# EasyEDA Pro project RK3566_handy_V1.0.epro, board PCB1_2
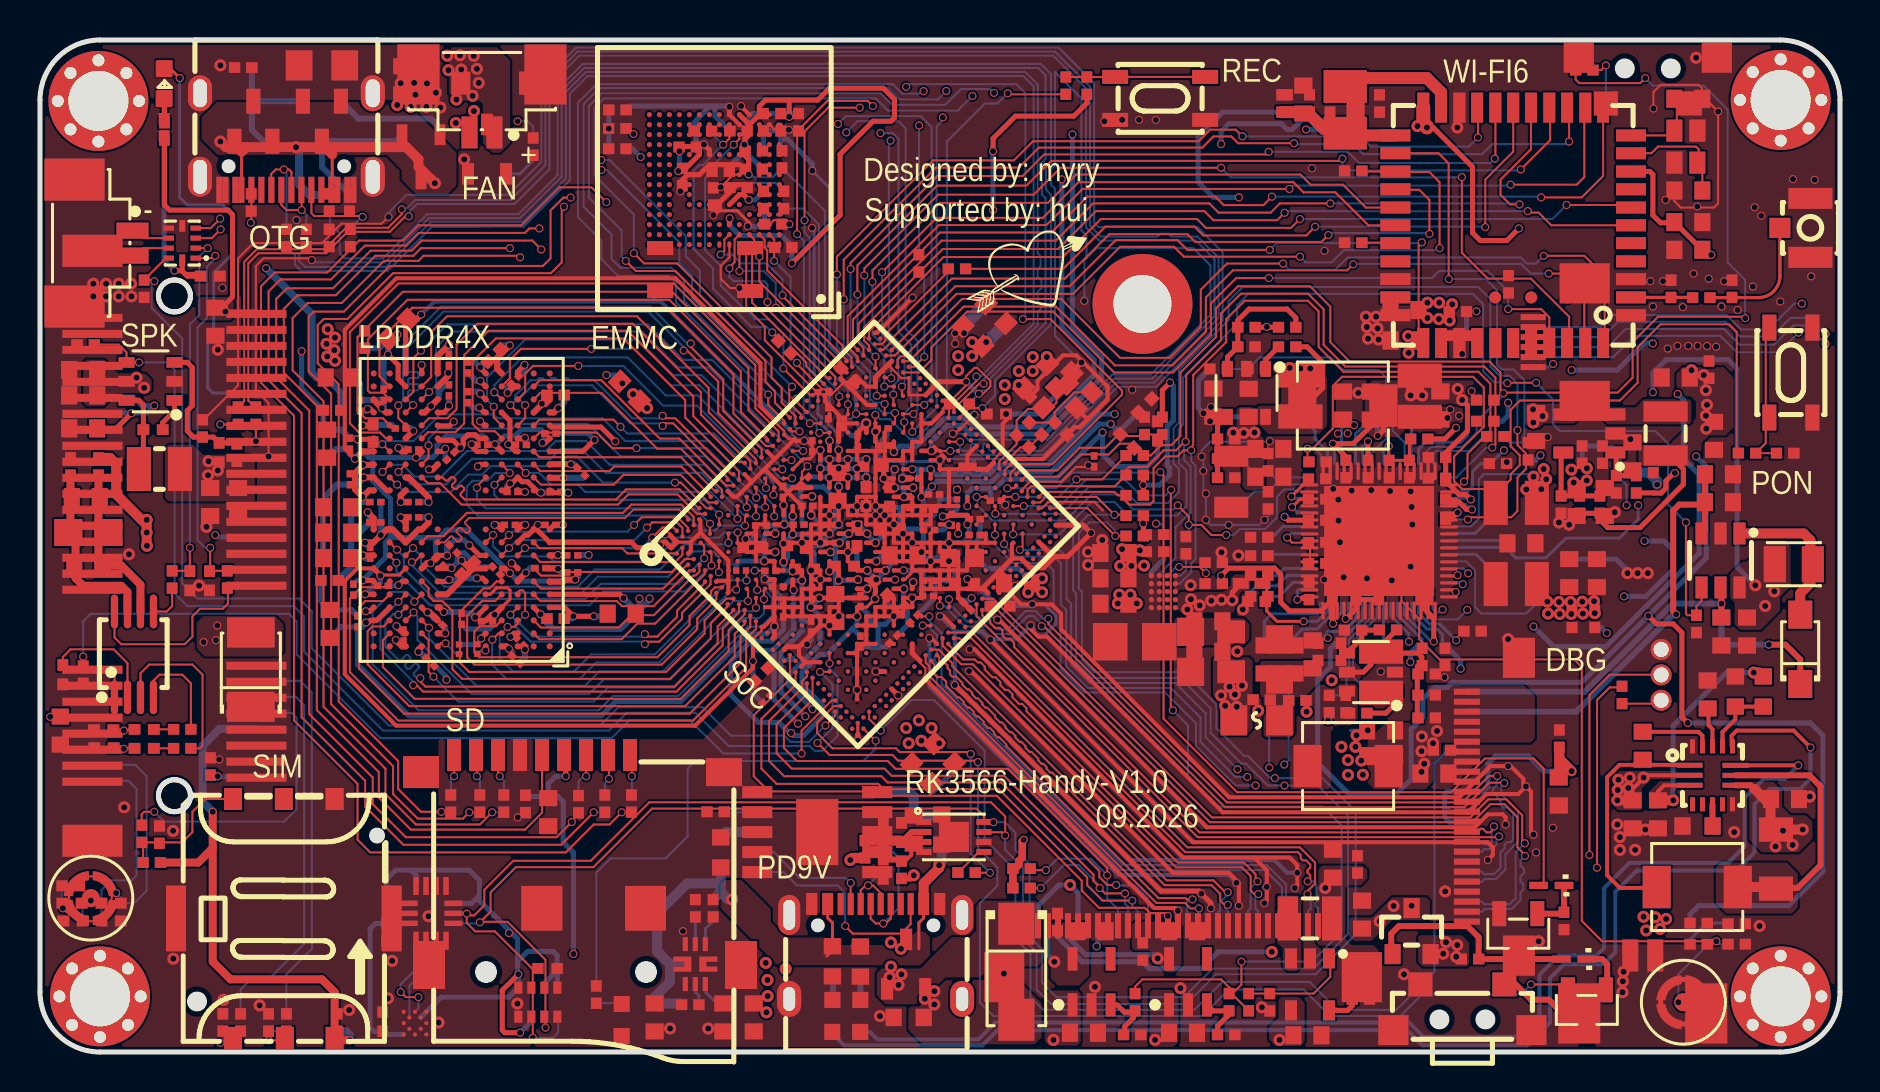
[diagram p25: board, top side]
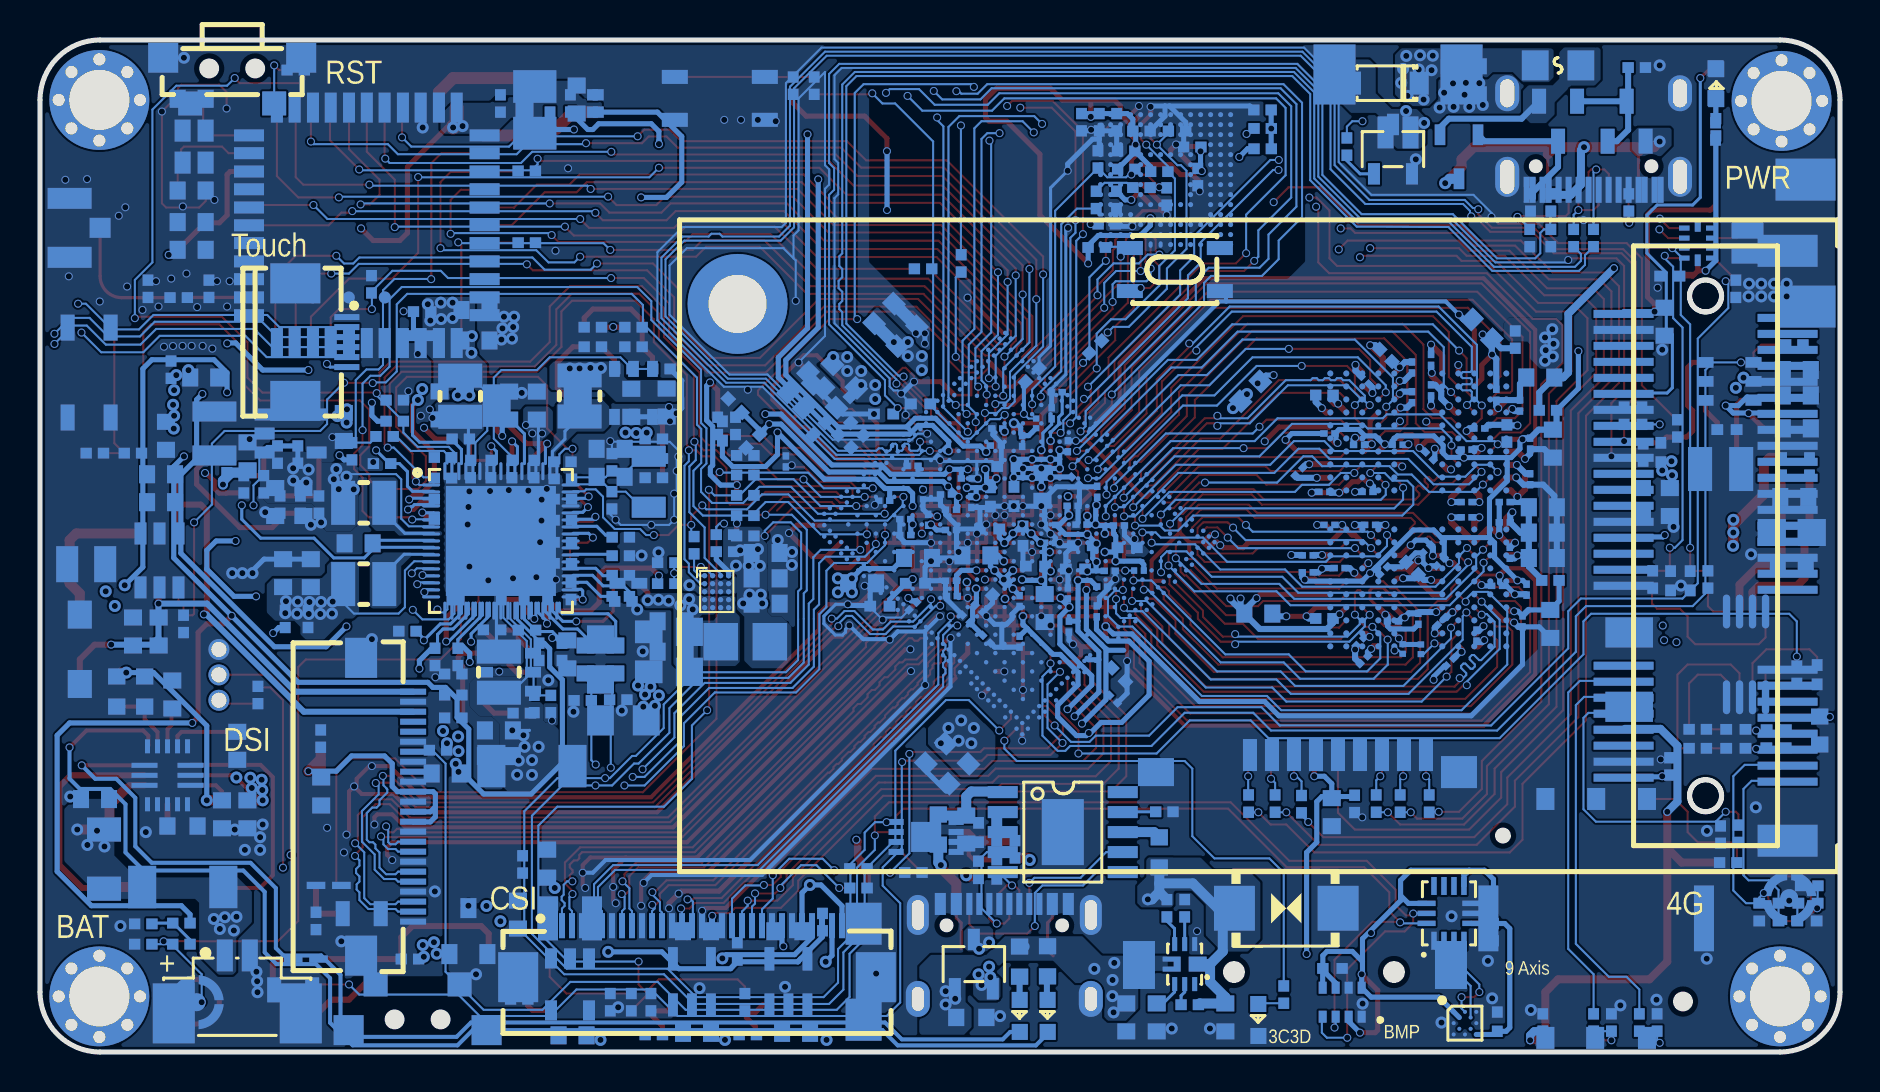
[diagram p26: board, bottom side, seen from below]

Outline 90 x 50.62 mm; copper layers: Top Layer, GND1, SIG+PWR, PWR, GND2, Bottom Layer. Coordinates in mm from the lower left corner of the outline.
Outline path: 0,47.62 0,3 arc(0.88,0.88) 3,0 87,0 arc(89.12,0.88) 90,3 90,47.62 arc(89.12,49.75) 87,50.62 3,50.62 arc(0.88,49.75) 0,47.62
Stack: Top Layer 0.035mm 外层铜厚1oz / Dielectric1 0.0994mm 3313 RC57% 4.2mil / GND1 0.0152mm 内层铜厚 / Dielectric2 0.55mm 0.55mm H/H No copper / SIG+PWR 0.0152mm 内层铜厚 / Dielectric3 0.1088mm 2116 RC54% 4.9mil / PWR 0.0152mm 内层铜厚 / Dielectric4 0.55mm 0.55mm H/H No copper / GND2 0.0152mm 内层铜厚 / Dielectric5 0.0994mm 3313 RC57% 4.2mil / Bottom Layer 0.035mm 外层铜厚1oz

## Design rules (mm)
net USB_OTG0_DP: USB_OTG
net USB_OTG0_DM: USB_OTG
net LPDDR4_DQS0P_A: LPDDR4_DQS0_A
net LPDDR4_DQS0N_A: LPDDR4_DQS0_A
net LPDDR4_DQS1N_A: LPDDR4_DQS1_A
net LPDDR4_DQS1P_A: LPDDR4_DQS1_A
net DPU: DP1
net MIPI_DSI_0P: MIPI_DSI_0
net LPDDR4_DQS1N_B: LPDDR4_DQS1_B
net LPDDR4_DQS1P_B: LPDDR4_DQS1_B
net MIPI_DSI_0N: MIPI_DSI_0
net MIPI_DSI_CLKP: MIPI_DSI_CLK
net LPDDR4_DQS0P_B: LPDDR4_DQS0_B
net LPDDR4_DQS0N_B: LPDDR4_DQS0_B
net MIPI_CSI_DN3: MII_CSI_3
net MIPI_CSI_DN2: MIPI_CSI_2
net MIPI_DSI_1N: MIPI_DSI_1
net MIPI_DSI_1P: MIPI_DSI_1
net DMU: DP1
net MIPI_DSI_CLKN: MIPI_DSI_CLK
net LPDDR4_CLKN_B: LPDDR4_CLK_B
net LPDDR4_CLKP_A: LPDDR4_CLK_A
net LPDDR4_CLKP_B: LPDDR4_CLK_B
net MIPI_CSI_MCN: MIPI_CLK
net MIPI_CSI_MCP: MIPI_CLK
net MIPI_CSI_DP3: MII_CSI_3
net MIPI_CSI_DP2: MIPI_CSI_2
net LPDDR4_CLKN_A: LPDDR4_CLK_A
net MIPI_CSI_DN1: MIPI_CSI_1
net MIPI_CSI_DP1: MIPI_CSI_1
net MIPI_CSI_DN0: MIPI_CSI_0
net MIPI_CSI_DP0: MIPI_CSI_0
net USB2_HOST2_DM: USB_HOST
net USB2_HOST2_DP: USB_HOST
net MIPI_DSI_3N: MIPI_DSI_3
net MIPI_DSI_2P: MIPI_DSI_2
net MIPI_DSI_3P: MIPI_DSI_3
net MIPI_DSI_2N: MIPI_DSI_2
spacing copperThickness1oz (default): track to track 0.102, other pairs 0.089 to 0.152
spacing copperThickness2oz: track to track 0.203, other pairs 0.152 to 0.3
spacing Copper_BGA网槽: track to track 0.102, other pairs 0.089 to 0.152
spacing Copper_copperRegion: track to track 0.102, other pairs 0.089 to 0.152
spacing Copper_power: track to track 0.102, other pairs 0.089 to 0.152
spacing Plane_innerPlane: track to track 0.102, other pairs 0.089 to 0.152
track width T_B_50_Ohm (default): min 0.089, default 0.254, max 2.54
track width SIGN_50_Ohm: min 0.142, default 0.142, max 2.54
differential pair 90_Ohm外层 (default): width min 0.089, default 0.102, max 2.54; gap min 0.089, default 0.102
differential pair 100_Ohm内层: width min 0.089, default 0.102, max 2.54; gap min 0.089, default 0.165
differential pair 100_Ohm外层: width min 0.089, default 0.102, max 2.54; gap min 0.089, default 0.14
differential pair 官方DEMO_DDR: width min 0.089, default 0.102, max 2.54; gap min 0.152, default 0.152
net VDD_LOGIC uses Copper_BGA网槽, Plane_innerPlane
pour e169 uses Copper_power, power_Copper_power
net GND uses Copper_copperRegion, Plane_innerPlane
pour e324 uses Copper_copperRegion, copperRegion_Copper_copperRegion
pour e552 uses Copper_copperRegion, copperRegion_Copper_copperRegion
pour e632 uses Copper_copperRegion, copperRegion_Copper_copperRegion
pour e639 uses Copper_copperRegion, copperRegion_Copper_copperRegion
net VCC0V6_DDR uses Copper_copperRegion, Plane_innerPlane
pour e649 uses Copper_copperRegion, copperRegion_Copper_copperRegion
net VCC5V0_SYS uses Copper_copperRegion, Plane_innerPlane
pour e683 uses Copper_copperRegion, copperRegion_Copper_copperRegion
net VCC3V3_SYS uses Copper_copperRegion, Plane_innerPlane
pour e1646 uses Copper_copperRegion, copperRegion_Copper_copperRegion
net VCC_SYS_IN uses copperRegion_copperThickness1oz
net VBAT uses copperRegion_copperThickness1oz
pour e1861 uses Copper_copperRegion, copperRegion_Copper_copperRegion
net VCC_3V3 uses Copper_copperRegion, Plane_innerPlane
pour e1955 uses Copper_copperRegion, copperRegion_Copper_copperRegion
net VDD_NPU uses Copper_copperRegion, Plane_innerPlane
pour e1963 uses Copper_copperRegion, copperRegion_Copper_copperRegion
pour e1976 uses Copper_copperRegion, power_Copper_copperRegion
pour e2035 uses Copper_copperRegion, copperRegion_Copper_copperRegion
net VDD2_DDR uses Copper_copperRegion, Plane_innerPlane
pour e2037 uses Copper_copperRegion, copperRegion_Copper_copperRegion
pour e2060 uses Copper_copperRegion, copperRegion_Copper_copperRegion
net VDD_GPU uses Copper_copperRegion, Plane_innerPlane
pour e2065 uses Copper_copperRegion, copperRegion_Copper_copperRegion
pour e2077 uses Copper_copperRegion, copperRegion_Copper_copperRegion
net VDD_CPU uses Copper_power, Plane_innerPlane
pour e2113 uses Copper_power, copperRegion_Copper_power
pour e1029 uses Copper_power, power_Copper_power
net VDDQ_DRAM uses Copper_power, Plane_innerPlane
pour e1017 uses Copper_power, power_Copper_power
pour e2239 uses Copper_BGA网槽, copperRegion_Copper_BGA网槽
pour e2249 uses Copper_BGA网槽, copperRegion_Copper_BGA网槽
net VCC_DCIN uses Copper_copperRegion, Plane_innerPlane
pour e2462 uses Copper_copperRegion, copperRegion_Copper_copperRegion
pour e2570 uses Copper_copperRegion, copperRegion_Copper_copperRegion
pour e2721 uses Copper_copperRegion, copperRegion_Copper_copperRegion
net $20N4414 uses copperRegion_copperThickness1oz
pour e2827 uses Copper_copperRegion, copperRegion_Copper_copperRegion
pour e2829 uses Copper_copperRegion, copperRegion_Copper_copperRegion
net $20N2099 uses copperRegion_copperThickness1oz
pour e2892 uses Copper_copperRegion, copperRegion_Copper_copperRegion
net $20N4401 uses copperRegion_copperThickness1oz
pour e2950 uses Copper_copperRegion, copperRegion_Copper_copperRegion
pour e2991 uses Copper_copperRegion, copperRegion_Copper_copperRegion
net VCC_4G uses copperRegion_copperThickness1oz
net VCC_SYS_OUT uses copperRegion_copperThickness1oz
pour e3115 uses Copper_copperRegion, copperRegion_Copper_copperRegion
net $20N4390 uses copperRegion_copperThickness1oz
pour e3147 uses Copper_copperRegion, copperRegion_Copper_copperRegion
net VCC_PD uses copperRegion_copperThickness1oz
net VCC_1V8 uses Copper_copperRegion, Plane_innerPlane
pour e3211 uses Copper_copperRegion, copperRegion_Copper_copperRegion
pour e3312 uses Copper_copperRegion, copperRegion_Copper_copperRegion
net $20N882 uses copperRegion_copperThickness1oz
net 4G_PWREN_H uses Copper_copperRegion, Plane_innerPlane
net $2N1039 uses Copper_copperRegion, Plane_innerPlane
net $3N1242 uses Copper_copperRegion, Plane_innerPlane
net $3N1252 uses Copper_copperRegion, Plane_innerPlane
net $4N2113 uses Copper_copperRegion, Plane_innerPlane
net $4N4845 uses Copper_copperRegion, Plane_innerPlane
net $6N1442 uses Copper_copperRegion, Plane_innerPlane
net $12N7016 uses Copper_copperRegion, Plane_innerPlane
net $17N1318 uses copperRegion_copperThickness1oz
net $21N515 uses copperRegion_copperThickness1oz
net $22N1640 uses copperRegion_copperThickness1oz
net $26N120 uses copperRegion_copperThickness1oz
net AUDIO_CTRL uses Copper_copperRegion, Plane_innerPlane
net BATTERY_ALRT uses Copper_copperRegion, Plane_innerPlane
net BT_REG_ON_H uses Copper_copperRegion, Plane_innerPlane
net BT_WAKE_HOST_H uses Copper_copperRegion, Plane_innerPlane
net DMU uses Copper_copperRegion, Plane_innerPlane
net DPU uses Copper_copperRegion, Plane_innerPlane
net DVP_PWREN_H uses Copper_copperRegion, Plane_innerPlane
net EMMC_CLKOUT uses Copper_copperRegion, Plane_innerPlane
net EMMC_DATA_STROBE uses Copper_copperRegion, Plane_innerPlane
net EMMC_DATA_STROBE/FLASH_CLE uses Copper_copperRegion, Plane_innerPlane
net EMMC_RSTN uses Copper_copperRegion, Plane_innerPlane
net FLASH_VOL_SEL uses Copper_copperRegion, Plane_innerPlane
net GPIO0_A5 uses Copper_copperRegion, Plane_innerPlane
net GPIO0_C5 uses Copper_copperRegion, Plane_innerPlane
net GPIO0_C6 uses Copper_copperRegion, Plane_innerPlane
net GPIO3_D7 uses Copper_copperRegion, Plane_innerPlane
net HOST_WAKE_BT_H uses Copper_copperRegion, Plane_innerPlane
net HP_SNS uses Copper_copperRegion, Plane_innerPlane
net HPL_OUT uses Copper_copperRegion, Plane_innerPlane
net HPR_OUT uses Copper_copperRegion, Plane_innerPlane
net HW_ID uses Copper_copperRegion, Plane_innerPlane
net I2C0_SCL_PMIC uses Copper_copperRegion, Plane_innerPlane
net I2C0_SDA_PMIC uses Copper_copperRegion, Plane_innerPlane
net I2C1_SCL_TP uses Copper_copperRegion, Plane_innerPlane
net I2C1_SDA_TP uses Copper_copperRegion, Plane_innerPlane
net I2C4_M0_SCL_CSI uses Copper_copperRegion, Plane_innerPlane
net I2C4_M0_SDA_CSI uses Copper_copperRegion, Plane_innerPlane
net I2S1_LRCK_TX_M0_PMIC uses Copper_copperRegion, Plane_innerPlane
net I2S1_MCLK_M0_PMIC uses Copper_copperRegion, Plane_innerPlane
net I2S1_SCLK_TX_M0_PMIC uses Copper_copperRegion, Plane_innerPlane
net I2S1_SDI0_M0/PDM uses Copper_copperRegion, Plane_innerPlane
net I2S1_SDO0_M0_PMIC uses Copper_copperRegion, Plane_innerPlane
net I2S2_LRCK_TX_M0 uses Copper_copperRegion, Plane_innerPlane
net I2S2_SCLK_TX_M0 uses Copper_copperRegion, Plane_innerPlane
net I2S2_SDI_M0 uses Copper_copperRegion, Plane_innerPlane
net I2S2_SDO_M0 uses Copper_copperRegion, Plane_innerPlane
net LPDDR4_A2_A uses Copper_copperRegion, Plane_innerPlane
net LPDDR4_A2_B uses Copper_copperRegion, Plane_innerPlane
net LPDDR4_A3_A uses Copper_copperRegion, Plane_innerPlane
net LPDDR4_A3_B uses Copper_copperRegion, Plane_innerPlane
net LPDDR4_A4_A uses Copper_copperRegion, Plane_innerPlane
net LPDDR4_A4_B uses Copper_copperRegion, Plane_innerPlane
net LPDDR4_A5_A uses Copper_copperRegion, Plane_innerPlane
net LPDDR4_A5_B uses Copper_copperRegion, Plane_innerPlane
net LPDDR4_CKE0_A uses Copper_copperRegion, Plane_innerPlane
net LPDDR4_CKE0_B uses Copper_copperRegion, Plane_innerPlane
net LPDDR4_CKE1_A uses Copper_copperRegion, Plane_innerPlane
net LPDDR4_CKE1_B uses Copper_copperRegion, Plane_innerPlane
net LPDDR4_CSN0_A uses Copper_copperRegion, Plane_innerPlane
net LPDDR4_CSN0_B uses Copper_copperRegion, Plane_innerPlane
net LPDDR4_CSN1_A uses Copper_copperRegion, Plane_innerPlane
net LPDDR4_CSN1_B uses Copper_copperRegion, Plane_innerPlane
net LPDDR4_DMI0_A uses Copper_copperRegion, Plane_innerPlane
net LPDDR4_DMI0_B uses Copper_copperRegion, Plane_innerPlane
net LPDDR4_DMI1_A uses Copper_copperRegion, Plane_innerPlane
net LPDDR4_DMI1_B uses Copper_copperRegion, Plane_innerPlane
net LPDDR4_DQ2_B uses Copper_copperRegion, Plane_innerPlane
net LPDDR4_DQ3_B uses Copper_copperRegion, Plane_innerPlane
net LPDDR4_DQ5_B uses Copper_copperRegion, Plane_innerPlane
net LPDDR4_DQ6_B uses Copper_copperRegion, Plane_innerPlane
net LPDDR4_DQ7_A uses Copper_copperRegion, Plane_innerPlane
net LPDDR4_DQ7_B uses Copper_copperRegion, Plane_innerPlane
net LPDDR4_DQ13_A uses Copper_copperRegion, Plane_innerPlane
net LPDDR4_DQ14_A uses Copper_copperRegion, Plane_innerPlane
net LPDDR4_DQ14_B uses Copper_copperRegion, Plane_innerPlane
net LPDDR4_DQ15_A uses Copper_copperRegion, Plane_innerPlane
net LPDDR4_DQS0N_A uses Copper_copperRegion, Plane_innerPlane, 官方DEMO_DDR
net LPDDR4_DQS0N_B uses Copper_copperRegion, Plane_innerPlane, 官方DEMO_DDR
net LPDDR4_DQS0P_A uses Copper_copperRegion, Plane_innerPlane, 官方DEMO_DDR
net LPDDR4_DQS0P_B uses Copper_copperRegion, Plane_innerPlane, 官方DEMO_DDR
net LPDDR4_DQS1N_A uses Copper_copperRegion, Plane_innerPlane, 官方DEMO_DDR
net LPDDR4_DQS1N_B uses Copper_copperRegion, Plane_innerPlane, 官方DEMO_DDR
net LPDDR4_DQS1P_A uses Copper_copperRegion, Plane_innerPlane, 官方DEMO_DDR
net LPDDR4_DQS1P_B uses Copper_copperRegion, Plane_innerPlane, 官方DEMO_DDR
net LPDDR4_RESET uses Copper_copperRegion, Plane_innerPlane
net MCLK_CSI uses Copper_copperRegion, Plane_innerPlane
net MIPI_CSI_DN0 uses 100_Ohm外层, Copper_copperRegion, Plane_innerPlane
net MIPI_CSI_DN1 uses 100_Ohm外层, Copper_copperRegion, Plane_innerPlane
net MIPI_CSI_DN2 uses 100_Ohm外层, Copper_copperRegion, Plane_innerPlane
net MIPI_CSI_DN3 uses 100_Ohm外层, Copper_copperRegion, Plane_innerPlane
net MIPI_CSI_DP0 uses 100_Ohm外层, Copper_copperRegion, Plane_innerPlane
net MIPI_CSI_DP1 uses 100_Ohm外层, Copper_copperRegion, Plane_innerPlane
net MIPI_CSI_DP2 uses 100_Ohm外层, Copper_copperRegion, Plane_innerPlane
net MIPI_CSI_DP3 uses 100_Ohm外层, Copper_copperRegion, Plane_innerPlane
net MIPI_CSI_MCN uses 100_Ohm外层, Copper_copperRegion, Plane_innerPlane
net MIPI_CSI_MCP uses 100_Ohm外层, Copper_copperRegion, Plane_innerPlane
net MIPI_DSI_0N uses 100_Ohm外层, Copper_copperRegion, Plane_innerPlane
net MIPI_DSI_0P uses 100_Ohm外层, Copper_copperRegion, Plane_innerPlane
net MIPI_DSI_1N uses 100_Ohm外层, Copper_copperRegion, Plane_innerPlane
net MIPI_DSI_1P uses 100_Ohm外层, Copper_copperRegion, Plane_innerPlane
net MIPI_DSI_2N uses 100_Ohm外层, Copper_copperRegion, Plane_innerPlane
net MIPI_DSI_2P uses 100_Ohm外层, Copper_copperRegion, Plane_innerPlane
net MIPI_DSI_3N uses 100_Ohm外层, Copper_copperRegion, Plane_innerPlane
net MIPI_DSI_3P uses 100_Ohm外层, Copper_copperRegion, Plane_innerPlane
net MIPI_DSI_CLKN uses 100_Ohm外层, Copper_copperRegion, Plane_innerPlane
net MIPI_DSI_CLKP uses 100_Ohm外层, Copper_copperRegion, Plane_innerPlane
net MIPI_DSI_RESET uses Copper_copperRegion, Plane_innerPlane
net MIPI_DSI_VCC_LED- uses Copper_copperRegion, Plane_innerPlane
net MIPI_DSI_VCC_LED+ uses Copper_copperRegion, Plane_innerPlane
net PDM_CLK0_M0_PMIC uses Copper_copperRegion, Plane_innerPlane
net PMIC_32KOUT_WIFI uses Copper_copperRegion, Plane_innerPlane
net PMIC_INT_L uses Copper_copperRegion, Plane_innerPlane
net PMIC_SLEEP_H uses Copper_copperRegion, Plane_innerPlane
net PWDN_CSI uses Copper_copperRegion, Plane_innerPlane
net PWRON_KEY uses Copper_copperRegion, Plane_innerPlane
net RESET_CSI uses Copper_copperRegion, Plane_innerPlane
net RESETN uses Copper_copperRegion, Plane_innerPlane
net SARADC_VIN0 uses Copper_copperRegion, Plane_innerPlane
net SDMMC0_D0 uses Copper_copperRegion, Plane_innerPlane
net SDMMC0_D1 uses Copper_copperRegion, Plane_innerPlane
net SDMMC0_D2 uses Copper_copperRegion, Plane_innerPlane
net SDMMC0_D3 uses Copper_copperRegion, Plane_innerPlane
net SDMMC0_CLK uses Copper_copperRegion, Plane_innerPlane
net SDMMC0_CMD uses Copper_copperRegion, Plane_innerPlane
net SDMMC0_DET_L uses Copper_copperRegion, Plane_innerPlane
net SDMMC1_D0 uses Copper_copperRegion, Plane_innerPlane
net SDMMC1_D1 uses Copper_copperRegion, Plane_innerPlane
net SDMMC1_D2 uses Copper_copperRegion, Plane_innerPlane
net SDMMC1_D3 uses Copper_copperRegion, Plane_innerPlane
net SDMMC1_CLK uses Copper_copperRegion, Plane_innerPlane
net SDMMC1_CMD uses Copper_copperRegion, Plane_innerPlane
net SPK_OUTN uses Copper_copperRegion, Plane_innerPlane
net SPK_OUTP uses Copper_copperRegion, Plane_innerPlane
net TP_INT uses Copper_copperRegion, Plane_innerPlane
net TP_RST uses Copper_copperRegion, Plane_innerPlane
net TSADC_SEUT_M0 uses Copper_copperRegion, Plane_innerPlane
net UART1_CTSN_M0 uses Copper_copperRegion, Plane_innerPlane
net UART1_RTSN_M0 uses Copper_copperRegion, Plane_innerPlane
net UART1_RX_M0 uses Copper_copperRegion, Plane_innerPlane
net UART1_TX_M0 uses Copper_copperRegion, Plane_innerPlane
net UART2_TX_M0_DEBUG uses Copper_copperRegion, Plane_innerPlane
net USB2_HOST2_DM uses Copper_copperRegion, Plane_innerPlane
net USB2_HOST2_DP uses Copper_copperRegion, Plane_innerPlane
net USB_OTG0_DM uses Copper_copperRegion, Plane_innerPlane
net USB_OTG0_DP uses Copper_copperRegion, Plane_innerPlane
net USB_OTG0_VBUSDET uses Copper_copperRegion, Plane_innerPlane
net USB_OTG_DM uses Copper_copperRegion, Plane_innerPlane
net USB_OTG_DP uses Copper_copperRegion, Plane_innerPlane
net VCC1V2 uses copperRegion_copperThickness1oz
net VCC1V8 uses copperRegion_copperThickness1oz
net VCC2V8 uses copperRegion_copperThickness1oz
net VCC3V3_PMU uses Copper_copperRegion, Plane_innerPlane
net VCC3V3_SD uses Copper_copperRegion, Plane_innerPlane
net VCC5V0_USB_OTG uses Copper_copperRegion, Plane_innerPlane
net VCC_C uses copperRegion_copperThickness1oz
net VCC_PD_VIN uses copperRegion_copperThickness1oz
net VCCA1V8_IMAGE uses Copper_copperRegion, Plane_innerPlane
net VCCA1V8_PMU uses Copper_copperRegion, Plane_innerPlane
net VCCA_1V8 uses Copper_copperRegion, Plane_innerPlane
net VCCIO_ACODEC uses Copper_copperRegion, Plane_innerPlane
net VCCIO_FLASH uses Copper_copperRegion, Plane_innerPlane
net VCCIO_SD uses Copper_copperRegion, Plane_innerPlane
net VCCIO_WL uses Copper_copperRegion, Plane_innerPlane
net VDD1_1V8_DDR uses Copper_copperRegion, Plane_innerPlane
net VDDA0V9_IMAGE uses Copper_copperRegion, Plane_innerPlane
net VDDA0V9_PMU uses Copper_copperRegion, Plane_innerPlane
net VDDA_0V9 uses Copper_copperRegion, Plane_innerPlane
net VIN_LDO uses Copper_copperRegion, Plane_innerPlane
net VIN_LDO_OUT uses Copper_copperRegion, Plane_innerPlane
net VSEL_EXTDCDC uses Copper_copperRegion, Plane_innerPlane
net WIFI_REG_ON_H uses Copper_copperRegion, Plane_innerPlane
net WIFI_WAKE_HOST_H uses Copper_copperRegion, Plane_innerPlane
net WIFI_XTAL_IN uses Copper_copperRegion, Plane_innerPlane
net WIFI_XTAL_OUT uses Copper_copperRegion, Plane_innerPlane
net XIN24M uses Copper_copperRegion, Plane_innerPlane
net XOUT24M uses Copper_copperRegion, Plane_innerPlane
diff pair LPDDR4_CLK_A uses 官方DEMO_DDR
diff pair LPDDR4_CLK_B uses 官方DEMO_DDR
diff pair MII_CSI_3 uses 100_Ohm外层
diff pair MIPI_CSI_2 uses 100_Ohm外层
diff pair MIPI_CSI_1 uses 100_Ohm外层
diff pair MIPI_CLK uses 100_Ohm外层
diff pair MIPI_CSI_0 uses 100_Ohm外层
diff pair MIPI_DSI_0 uses 100_Ohm外层
diff pair MIPI_DSI_CLK uses 100_Ohm外层
diff pair MIPI_DSI_1 uses 100_Ohm外层
diff pair MIPI_DSI_3 uses 100_Ohm外层
diff pair MIPI_DSI_2 uses 100_Ohm外层
diff pair LPDDR4_DQS0_B uses 官方DEMO_DDR
diff pair LPDDR4_DQS0_A uses 官方DEMO_DDR
diff pair LPDDR4_DQS1_B uses 官方DEMO_DDR
diff pair LPDDR4_DQS1_A uses 官方DEMO_DDR
net EMMC_CMD uses Copper_copperRegion, Plane_innerPlane
net EMMC_D0 uses Copper_copperRegion, Plane_innerPlane
net EMMC_D1 uses Copper_copperRegion, Plane_innerPlane
net EMMC_D2 uses Copper_copperRegion, Plane_innerPlane
net EMMC_D6 uses Copper_copperRegion, Plane_innerPlane
net EMMC_D7 uses Copper_copperRegion, Plane_innerPlane
net EMMC_D3 uses Copper_copperRegion, Plane_innerPlane
net EMMC_D4 uses Copper_copperRegion, Plane_innerPlane
net EMMC_D5 uses Copper_copperRegion, Plane_innerPlane
net LPDDR4_A0_A uses Copper_copperRegion, Plane_innerPlane
net LPDDR4_A1_A uses Copper_copperRegion, Plane_innerPlane
net LPDDR4_CLKP_A uses Copper_copperRegion, Plane_innerPlane, 官方DEMO_DDR
net LPDDR4_CLKN_A uses Copper_copperRegion, Plane_innerPlane, 官方DEMO_DDR
net LPDDR4_ODT0_CA_A uses Copper_copperRegion, Plane_innerPlane
net LPDDR4_A1_B uses Copper_copperRegion, Plane_innerPlane
net LPDDR4_CLKP_B uses Copper_copperRegion, Plane_innerPlane, 官方DEMO_DDR
net LPDDR4_CLKN_B uses Copper_copperRegion, Plane_innerPlane, 官方DEMO_DDR
net LPDDR4_A0_B uses Copper_copperRegion, Plane_innerPlane
net LPDDR4_ODT0_CA_B uses Copper_copperRegion, Plane_innerPlane
net LPDDR4_DQ0_A uses Copper_copperRegion, Plane_innerPlane
net LPDDR4_DQ1_A uses Copper_copperRegion, Plane_innerPlane
net LPDDR4_DQ6_A uses Copper_copperRegion, Plane_innerPlane
net LPDDR4_DQ2_A uses Copper_copperRegion, Plane_innerPlane
net LPDDR4_DQ5_A uses Copper_copperRegion, Plane_innerPlane
net LPDDR4_DQ3_A uses Copper_copperRegion, Plane_innerPlane
net LPDDR4_DQ4_A uses Copper_copperRegion, Plane_innerPlane
net LPDDR4_DQ8_A uses Copper_copperRegion, Plane_innerPlane
net LPDDR4_DQ9_A uses Copper_copperRegion, Plane_innerPlane
net LPDDR4_DQ10_A uses Copper_copperRegion, Plane_innerPlane
net LPDDR4_DQ12_A uses Copper_copperRegion, Plane_innerPlane
net LPDDR4_DQ11_A uses Copper_copperRegion, Plane_innerPlane
net LPDDR4_DQ4_B uses Copper_copperRegion, Plane_innerPlane
net LPDDR4_DQ1_B uses Copper_copperRegion, Plane_innerPlane
net LPDDR4_DQ0_B uses Copper_copperRegion, Plane_innerPlane
net LPDDR4_DQ12_B uses Copper_copperRegion, Plane_innerPlane
net LPDDR4_DQ11_B uses Copper_copperRegion, Plane_innerPlane
net LPDDR4_DQ13_B uses Copper_copperRegion, Plane_innerPlane
net LPDDR4_DQ10_B uses Copper_copperRegion, Plane_innerPlane
net LPDDR4_DQ9_B uses Copper_copperRegion, Plane_innerPlane
net LPDDR4_DQ15_B uses Copper_copperRegion, Plane_innerPlane
net LPDDR4_DQ8_B uses Copper_copperRegion, Plane_innerPlane
region e8675 uses BGA网槽, copperThickness1oz, innerPlane, otherClearance, viaSize
pour e3738 uses Copper_copperRegion, copperRegion_Copper_copperRegion
pour e3756 uses Copper_copperRegion, copperRegion_Copper_copperRegion
pour e3763 uses Copper_copperRegion, copperRegion_Copper_copperRegion
pour e3782 uses Copper_copperRegion, copperRegion_Copper_copperRegion
pour e8681 uses Copper_copperRegion, copperRegion_Copper_copperRegion
pour e8683 uses Copper_power, copperRegion_Copper_power
pour e9957 uses Copper_copperRegion, copperRegion_Copper_copperRegion
pour e10094 uses Copper_copperRegion, copperRegion_Copper_copperRegion
pour e10540 uses Copper_copperRegion, copperRegion_Copper_copperRegion
pour e10680 uses Copper_copperRegion, copperRegion_Copper_copperRegion
pour e10682 uses Copper_copperRegion, copperRegion_Copper_copperRegion
pour e10684 uses Copper_copperRegion, copperRegion_Copper_copperRegion

## Placement (name value [footprint] x y rotation side)
C1  4.7uF  [CC0402]  41.66 29.29 180 bottom
C2  100nF  [c0402]  5.65 31.13 0 top
C3  22uF  [CC_0603]  39.88 28.27 90 bottom
C4  22uF  [CC_0603]  47.8 36.94 315 bottom
C5  22pF  [c0402]  8.95 29.99 270 top
C6  100nF  [c_0603]  2.16 32.84 0 top
C7  100nF  [c_0603]  8.51 27.51 90 top
C8  22uF  [c_0603]  2.16 34.11 0 top
C9  100nF  [c0402]  8.51 38.81 0 top
C10  10uF  [C0603#2]  66.1 6.87 270 top
C13  1uF  [c0402]  43.07 10.98 270 top
C14  1uF  [c0402]  42.16 9.14 90 top
C15  100nF  [R0402]  24.27 12.41 90 bottom
C16  10uF  [C0603#2]  35.69 1.73 90 bottom
C17  100pF  [C0603#2]  34.16 1.73 270 bottom
C18  1uF  [C0603#2]  30.73 1.73 90 bottom
C19  10uF  [C0603#2]  43.69 11.13 90 bottom
C20  100nF  [C0603#2]  80.14 15.32 90 top
C21  33pF  [C0402]  8.51 14.3 90 top
C23  10uF  [C0603#2]  2.16 31.19 180 top
C24  100nF  [C0402#2]  17.14 1.55 270 bottom
C25  100nF  [C0402]  17.31 5.98 270 bottom
C27  1nF  [c0402]  7.49 23.57 90 top
C28  1nF  [c0402]  8.47 23.57 90 top
C29  100nF  [c0402]  5.21 15.19 0 top
C30  100nF  [c0402]  5.21 16.14 0 top
C31  1uF  [c0402]  1.14 18.87 90 top
C32  1uF  [c_0603]  2.41 24.34 0 top
C33  22uF  [C0805]  2.41 25.99 0 top
C34  22uF  [c_0603]  2.29 27.76 0 top
C35  22pF  [c0402]  3.2 15.22 0 top
C36  22pF  [c0402]  3.19 16.12 0 top
C37  10pF  [c0402]  1.65 6.56 180 bottom
C38  33pF  [c0402]  3.56 6.56 0 bottom
C39  10pF  [c0402]  1.6 7.44 0 bottom
C40  33pF  [c0402]  3.56 7.44 180 bottom
C41  100nF  [CC_0201]  47.79 27.58 180 bottom
C42  1uF  [CC_0201]  38.55 21.28 270 bottom
C48  1uF  [CC0402]  48.01 22.3 180 bottom
C49  100nF  [CC_0201]  39.16 33.01 0 bottom
C55  22uF  [C0603]  8.76 36.53 90 top
C56  100uF  [CASE-B_3528]  10.54 19.13 90 top
C58  100nF  [C0402#2]  25.35 4.18 0 bottom
C59  100nF  [CC0402]  54.36 30.56 135 bottom
C60  4.7uF  [CC0402]  55.25 32.34 45 bottom
C61  100nF  [CC_0201]  37.16 22.04 270 bottom
C62  100nF  [CC_0201]  42.13 31.19 180 bottom
C63  1nF  [CC0402]  45.97 32.42 0 bottom
C64  1nF  [CC0402]  40.39 33.86 135 bottom
C65  100nF  [CC_0201]  40.89 30.56 90 bottom
C66  1uF  [CC_0201]  44.41 22.81 0 bottom
C67  100nF  [CC_0201]  44.45 23.57 180 bottom
C68  1uF  [CC_0201]  43.05 22.18 225 bottom
C69  100nF  [CC_0201]  42.67 20.65 45 bottom
C70  100nF  [CC_0201]  38.61 22.94 270 bottom
C71  100nF  [CC_0201]  43.69 21.67 225 bottom
C72  100nF  [CC_0201]  46.35 22.3 135 bottom
C74  1uF  [C0603#2]  83.38 17.89 270 top
C75  1uF  [C0603#2]  80.9 11.89 90 top
C76  10uF  [C0603#2]  79.63 11.89 90 top
C77  22uF  [C0603#2]  87.25 12.65 0 top
C88  100nF  [CC_0201]  41.02 20.53 90 bottom
C89  100nF  [CC_0201]  39.42 31.95 270 bottom
C90  100nF  [LL_0402]  65.91 16.97 180 top
C91  10uF  [C0805]  61.98 19.64 270 top
C92  100nF  [LL_0603]  63.63 19.89 90 top
C93  22pF  [LL_0402]  69.33 17.87 180 top
C94  10uF  [LL_0603]  69.72 13.94 0 top
C95  100nF  [LL_0402]  70.1 15.08 0 top
C96  100nF  [LL_0402]  65.65 21.12 180 top
C97  2.2uF  [C0805]  57.53 20.02 90 top
C98  100nF  [LL_0402]  62.36 35.26 0 top
C99  10uF  [LL_0603]  61.47 28.78 0 top
C100  100nF  [LL_0603]  61.47 30.18 0 top
C101  22pF  [LL_0402]  60.32 36.27 180 top
C102  100nF  [LL_0603]  70.03 32.34 270 top
C103  100nF  [LL_0402]  59.31 28.71 0 top
C104  22uF  [LL_0603]  68.76 32.35 270 top
C105  22uF  [LL_0603]  74.07 25.44 0 bottom
C106  10uF  [LL_0402]  69.85 29.72 0 top
C107  1uF  [LL_0402]  66.96 23.07 90 top
C108  1uF  [LL_0402]  69.09 19.76 90 bottom
C109  1uF  [LL_0402]  70.23 19.76 90 bottom
C110  1uF  [LL_0402]  71.63 21.03 180 bottom
C111  1uF  [LL_0402]  77.72 21.67 90 bottom
C112  22uF  [LL_0603]  76.45 23.95 270 bottom
C113  10uF  [LL_0603]  77.85 23.95 90 bottom
C114  22uF  [LL_0603]  68.23 37.11 0 bottom
C115  10uF  [LL_0603]  68.23 35.6 180 bottom
C116  1uF  [LL_0402]  70.89 35.85 0 bottom
C117  1uF  [LL_0402]  65.81 23.07 90 top
C118  1uF  [LL_0402]  65.03 20.02 90 bottom
C119  1uF  [LL_0402]  63.88 20.02 90 bottom
C120  1uF  [LL_0402]  64.6 23.07 270 top
C121  1uF  [LL_0402]  69.85 28.73 180 top
C122  1uF  [LL_0402]  72.9 29.42 180 bottom
C123  10uF  [LL_0603]  69.22 23.45 90 top
C124  1uF  [LL_0402]  69.85 27.64 0 top
C125  1uF  [LL_0402]  69.85 26.62 0 top
C126  1uF  [LL_0402]  78.1 29.88 90 bottom
C127  22uF  [LL_0603]  76.84 27.51 90 bottom
C128  10uF  [LL_0603]  78.23 27.51 270 bottom
C129  1uF  [LL_0402]  65.28 29.16 270 top
C130  1uF  [LL_0402]  66.42 29.16 90 top
C131  22uF  [LL_0603]  67.06 14.81 180 bottom
C132  10uF  [LL_0603]  67.06 16.08 0 bottom
C133  10uF  [LL_0603]  65.15 32.34 270 bottom
C134  10uF  [LL_0603]  66.55 32.34 90 bottom
C135  22uF  [LL_0603]  58.67 32.49 90 bottom
C136  10uF  [LL_0603]  60.43 32.48 270 bottom
C137  1uF  [LL_0402]  63.86 27.64 0 top
C138  1uF  [LL_0402]  63.86 26.62 180 top
C139  10uF  [LL_0402]  60.83 22.56 180 top
C140  12pF  [LL_0402]  61.42 27.6 270 bottom
C141  4.7uF  [LL_0402]  60.96 22.81 0 bottom
C142  100pF  [LL_0402]  60.96 24.84 0 bottom
C143  12pF  [LL_0402]  61.42 29.5 270 bottom
C144  1uF  [LL_0402]  60.96 23.83 180 bottom
C145  1uF  [LL_0402]  63.47 23.07 90 top
C146  1uF  [LL_0402]  63.86 28.65 0 top
C147  1uF  [LL_0402]  60.96 25.73 180 bottom
C148  680pF  [LL_0402]  62.87 17.6 0 bottom
C149  680pF  [LL_0402]  61.09 17.6 180 bottom
C150  100nF  [LL_0402]  63.86 24.46 180 top
C151  100nF  [LL_0402]  68.45 29.16 270 top
C152  27pF  [LL_0402]  63.86 25.48 0 top
C153  100nF  [LL_0402]  72.26 32.59 180 bottom
C154  100nF  [LL_0402]  63.88 29.54 180 top
C155  22uF  [LL_0603]  58.42 21.54 0 bottom
C156  22uF  [LL_0603]  58.42 20.02 0 bottom
C157  1uF  [LL_0402]  55.75 25.01 180 bottom
C158  22uF  [LL_0603]  53.72 23.7 180 bottom
C159  22uF  [LL_0603]  53.72 22.43 180 bottom
C160  22uF  [LL_0603]  53.72 24.97 180 bottom
C161  NC  [LL_0402]  58.69 24.5 0 bottom
C162  1uF  [LL_0402]  62.36 47.45 90 bottom
C163  4.7uF  [LL_0402]  28.88 47.14 0 bottom
C169  10uF  [LL_0603]  18.1 48.61 270 bottom
C170  100nF  [LL_0603]  19.5 48.61 270 bottom
C235  10uF  [LL_0603]  52.2 0.97 0 top
C236  4.7uF  [LL_0603]  52.58 6.05 0 top
C237  100nF  [LL_0402]  50.89 6.5 90 top
C238  100nF  [LL_0402]  54.61 0.84 0 top
C239  10uF  [LL_0603]  57.15 0.97 0 top
C240  4.7uF  [LL_0603]  57.15 6.05 0 top
C241  100nF  [LL_0402]  55.12 5.03 270 top
C242  100nF  [LL_0402]  59.31 0.84 0 top
C243  10uF  [LL_0603]  63.37 0.84 0 top
C244  100pF  [LL_0402]  66.04 3.51 180 top
C245  22uF  [LL_0603]  64.64 9.42 90 top
C246  100nF  [LL_0402]  65.89 9.38 90 top
C247  100nF  [LL_0402]  61.47 2.49 270 top
C248  1uF  [LL_0603]  84.07 21.03 270 top
C249  4.7uF  [LL_0603]  85.34 21.03 90 top
C250  100nF  [LL_0402]  75.98 15.68 90 top
C251  10uF  [LL_0603]  75.95 13.03 270 top
C252  100nF  [LL_0402]  80.64 29.42 90 bottom
C253  10uF  [LL_0603]  79.63 29.8 90 bottom
C259  NC  [LL_0402]  84.58 38.18 270 top
C260  NC  [LL_0402]  81.53 38.18 270 top
C261  10pF  [LL_0402]  83.06 37.72 0 top
C262  100nF  [LL_0603]  82.42 41.52 0 top
C263  1uF  [LL_0603]  82.42 40.12 180 top
C264  12pF  [LL_0603]  82.42 47.69 0 top
C265  12pF  [LL_0603]  82.42 43.09 180 top
C266  1uF  [LL_0402]  66.96 47.45 90 bottom
C267  100nF  [LL_0603]  65.78 47.83 90 bottom
C268  4.7uF  [LL_0402]  62.1 47.45 90 top
C269  100nF  [LL_0603]  63.16 47.65 90 top
C270  10uF  [C0603#2]  25.41 12 90 bottom
C272  1uF  [LL_0402]  84.84 6.43 0 bottom
C273  220pF  [LL_0402]  84.84 5.41 0 bottom
C278  100nF  [LL_0402]  87.26 29.94 0 top
C333  22uF  [c_0603]  9.91 27.51 90 top
C337  22uF  [LL_0603]  74.8 31.27 90 top
C338  22uF  [LL_0603]  83.71 30.82 270 top
C339  22uF  [LL_0603]  81.79 33.73 180 top
C340  100nF  [LL_0402]  83.47 34.13 90 top
C341  100nF/NC  [LL_0402]  78.79 28.4 270 top
C342  22pF  [LL_0402]  77.98 27.38 270 top
C563  1nF  [LL_0402]  16.64 30.94 90 bottom
C564  10uF  [LL_0603]  14.99 33.73 0 bottom
C565  10uF  [LL_0603]  14.48 21.41 270 bottom
C566  10uF  [LL_0603]  17.91 36.15 45 bottom
C567  1uF  [LL_0402]  25.78 21.67 180 bottom
C568  1uF  [LL_0402]  25.78 32.84 180 bottom
C584  10uF  [LL_0603]  14.86 25.99 180 bottom
C585  10uF  [LL_0603]  14.86 27.26 180 bottom
C586  1uF  [LL_0402]  22.72 34.83 225 bottom
C587  1uF  [LL_0402]  21.37 24.2 45 bottom
C598  10uF  [LL_0603]  14.35 30.43 270 bottom
C645  10pF-NC  [LL_0402]  33.15 46.05 180 bottom
C646  2.2uF  [LL_0402]  36.66 41.43 0 bottom
C647  100nF  [LL_0402]  32.38 45.29 0 bottom
C648  100nF  [LL_0402]  36.19 42.62 270 bottom
C649  100nF  [LL_0402]  34.92 46.05 180 bottom
C650  100nF  [LL_0402]  37.06 46.51 270 bottom
C651  4.7uF  [LL_0402]  37.94 46.51 270 bottom
C652  4.7uF  [LL_0402]  32.13 43.77 270 bottom
C826  100nF  [CC_0201]  20.45 34.62 270 bottom
C827  100nF  [CC_0201]  18.03 31.19 0 bottom
C828  100nF  [CC_0201]  17.18 32.88 90 bottom
C829  100nF  [CC_0201]  21.4 34.24 270 bottom
C830  100nF  [CC_0201]  16 32.34 270 bottom
C831  100nF  [CC_0201]  25.02 24.21 180 bottom
C832  100nF  [CC_0201]  24.05 30.37 0 bottom
C833  100nF  [CC_0201]  23.75 33.61 225 bottom
C834  100nF  [CC_0201]  21.08 21.67 90 bottom
C835  100nF  [CC_0201]  24 20.53 135 bottom
C836  100nF  [CC_0201]  22.35 21.54 180 bottom
C837  100nF  [CC_0201]  17.14 23.32 0 bottom
C838  100nF  [CC_0201]  18.17 20.83 90 bottom
C839  100nF  [CC_0201]  15.88 21.54 90 bottom
C850  100nF  [CC_0201]  16.76 26.49 180 bottom
C851  100nF  [CC_0201]  20.53 29.82 45 bottom
C852  100nF  [CC_0201]  15.49 28.65 90 bottom
C853  100nF  [CC_0201]  16.76 27.51 180 bottom
C854  100nF  [CC_0201]  27.05 29.03 135 bottom
C855  100nF  [CC_0201]  18.67 27.51 180 bottom
C856  100nF  [CC_0201]  16.51 24.97 270 bottom
C857  100nF  [CC_0201]  25.53 26.37 0 bottom
C858  100nF  [CC_0201]  26.61 24.84 180 bottom
C859  100nF  [CC_0201]  18.67 26.75 180 bottom
C860  100nF  [CC_0201]  26.61 23.99 0 bottom
C861  100nF  [CC_0201]  25.53 30.94 180 bottom
C862  100nF  [CC_0201]  22.12 30.38 0 bottom
C863  100nF  [CC_0201]  15.49 30.43 90 bottom
C864  100nF  [CC_0201]  22.82 24.08 315 bottom
C865  100nF  [CC_0201]  18.67 30.13 0 bottom
C866  100nF  [CC_0201]  15.67 23.13 90 bottom
C867  100nF  [CC_0201]  19.98 24.51 135 bottom
C868  22uF  [LL_0603]  29.08 21.92 0 bottom
C869  22uF  [LL_0603]  14.86 24.72 180 bottom
C870  100nF  [LL_0402]  37.08 44.65 90 bottom
C871  100nF  [LL_0402]  35.69 45.09 0 bottom
C872  100nF  [LL_0402]  36.19 46.51 270 bottom
C879  4.7uF  [CC0402]  41.3 27.79 90 bottom
C880  4.7uF  [CC0402]  40.85 25.8 90 bottom
C881  4.7uF  [CC0402]  42.52 26.16 180 bottom
C882  4.7uF  [CC0402]  40.22 24.3 180 bottom
C883  4.7uF  [CC0402]  42.04 23.19 135 bottom
C884  100nF  [CC_0201]  43.43 27.51 90 bottom
C885  100nF  [CC_0201]  41.02 22.56 90 bottom
C886  100nF  [CC_0201]  39.5 25.47 0 bottom
C887  100nF  [CC_0201]  38.61 30.3 270 bottom
C888  100nF  [CC_0201]  38.22 28.57 45 bottom
C889  10uF  [CC0402]  42.48 27.76 90 bottom
C890  10uF  [CC_0603]  48.89 23.45 0 bottom
C891  10uF  [CC_0603]  44.07 13.92 135 bottom
C892  22uF  [CC_0603]  46.64 35.81 315 bottom
C893  22uF  [CC_0603]  39.77 22.21 90 bottom
C894  22uF  [CC_0603]  45.21 14.94 135 bottom
C895  22uF  [CC_0603]  43.18 24.84 180 bottom
C896  22uF  [CC_0603]  46.1 24.72 0 bottom
C897  22uF  [CC_0603]  50.87 33.91 135 bottom
C898  22uF  [CC_0603]  49.68 32.73 135 bottom
C899  4.7uF  [CC0402]  35.64 25.23 0 bottom
C900  4.7uF  [CC0402]  38.23 24.16 180 bottom
C901  4.7uF  [CC0402]  37.85 25.33 180 bottom
C902  100nF  [CC_0201]  36.51 24.07 0 bottom
C903  100nF  [CC_0201]  39.5 26.37 180 bottom
C904  100nF  [CC_0201]  38.37 27.32 0 bottom
C905  100nF  [CC_0201]  36.05 26.34 0 bottom
C906  100nF  [CC_0201]  37.14 28.02 270 bottom
C907  100nF  [CC_0201]  37.92 26.38 180 bottom
C908  10uF  [CC_0603]  29.48 33.05 315 bottom
C909  12pF  [LL_0402]  51.05 31.19 135 top
C910  12pF  [LL_0402]  49.78 32.46 315 top
C911  1uF  [CC0402]  46.23 23.45 0 bottom
C912  1uF  [CC0402]  55.88 31.07 90 bottom
C913  1uF  [CC0402]  36.07 18.87 225 bottom
C914  100nF  [CC_0201]  46.74 25.86 180 bottom
C915  100nF  [CC_0201]  36.89 23.28 0 bottom
C916  100nF  [CC_0201]  36.33 17.65 45 bottom
C917  100nF  [CC_0201]  52.7 29.54 90 top
C918  100nF  [CC_0201]  44.45 26.11 0 bottom
C919  100nF  [CC_0201]  45.59 26.62 270 bottom
C920  100nF  [CC_0201]  46.74 26.66 180 bottom
C921  100nF  [CC_0201]  44.92 29.95 135 bottom
C922  100nF  [CC_0201]  46.37 29.32 180 bottom
C923  100nF  [CC_0201]  44.7 27.89 180 bottom
C927  100nF  [CC_0201]  43.66 28.69 0 bottom
C928  100nF  [CC0402]  47.82 31.92 180 bottom
C929  100nF  [CC_0201]  21.4 32.76 270 bottom
C930  100nF  [CC_0201]  20.45 33.1 270 bottom
C931  100nF  [CC_0201]  19.94 21.54 315 bottom
C933  100nF  [CC_0201]  23.8 19.62 135 bottom
C934  100nF  [CC_0201]  19.5 19.51 135 bottom
C935  100nF  [CC_0201]  20.66 25.16 135 bottom
C936  100nF  [CC_0201]  23.49 26.37 0 bottom
C937  100nF  [CC_0201]  25.78 28.02 0 bottom
C938  100nF  [CC_0201]  23.62 28.02 0 bottom
C942  100nF  [CC_0201]  42.21 30.34 0 bottom
C950  100nF  [CC_0201]  44.45 27.13 180 bottom
CARD1  SMN-304  [SIM-SMD_SMN-304]  12.19 6.68 0 top
CARD2  TF-15x15  [TF-SMD_TF-15-15]  27.05 9.6 270 top
D2  KLXES15AAA1  [r0402]  9.14 1.48 90 bottom
D3  KLXES15AAA1  [r0402]  11.43 1.48 90 bottom
D4  KLXES15AAA1  [r0402]  14.86 1.48 90 bottom
D5  KLXES15AAA1  [r0402]  5.97 10.87 90 top
D6  1N4148WT  [SOD-523_L1.2-W0.8-LS1.6-RD]  75.56 8.33 180 top
D7  DSK34  [SOD-123FL_L2.7-W1.8-LS3.8-RD]  88.01 20.14 90 top
D8  BAT54C  [SOT-23-3_L2.9-W1.3-P1.90-LS2.4-BR]  77.34 2.11 90 top
D9  1N4148WT  [SOD-523_L1.2-W0.8-LS1.6-RD]  76.71 4.65 180 top
D10  B5819LW  [SOD-123_L2.8-W1.8-LS3.7-RD]  22.73 48.47 0 bottom
D21  SMBJ15CA  [SMB_L4.6-W3.6-LS5.3-BI]  27.69 7.19 0 bottom
F1  BSMD0805L-200  [F0805]  60.83 16.59 0 top
F2  BSMD0805L-200  [F0805]  14.1 49.35 0 bottom
FPC1  FPC-05F-6PH20  [FPC-SMD_6P-P0.50_XUNPU_FPC-05F-6PH20]  75.95 35.51 270 bottom
FPC4  AFC01-S24FCA-00  [FPC-SMD_P0.50-24P_FGS-XJ-H2.0]  72.64 12.27 90 bottom
FPC6  FPC-05F-30PH20  [FPC-SMD_30P-P0.50_XUNPU_FPC-05F-30PH20]  57.15 5.03 180 bottom
H3  MH127V-11-03-H22-0820  [HDR-TH_3P-P1.27-V_PZ127V-11-03-H25]  81.06 18.87 90 top
L1  6.8uH  [IND-SMD_L4.4-W4.2]  82.86 8.25 0 top
L2  3.3uH  [IND-SMD_L4.4-W4.2]  65.14 32.34 180 top
L3  GZ1608D601TF  [L0603]  1.02 16.08 90 top
L8  BLM15AG121SN1D  [L0402]  60.58 23.45 0 top
L9  BLM18PG181SN1D  [L0603]  61.21 19.64 270 bottom
L10  BLM18PG181SN1D  [L0603]  62.74 19.64 270 bottom
L12  240nH  [IND-SMD_L2.5-W2.0_WPN252012H#2]  54.74 20.53 0 bottom
L16  6.8uH  [IND-SMD_L4.4-W4.2]  65.41 14.3 180 top
L17  4.7uH  [L1008]  65.26 47.13 90 top
L20  10uH  [IND-SMD_L2.5-W2.0_WPN252012H]  87.69 24.4 0 top
L21  2.2uH  [IND-SMD_L2.5-W2.0_MHCHL2520]  81.28 30.94 270 top
L22  2.2uH  [IND-SMD_L2.5-W2.0_MHCHL2520]  63.5 6.68 0 top
LED1  -  [LED_0603]  41.02 1.86 90 bottom
LED2  KT-0603B  [LED0603-RD]  6.19 48.42 270 bottom
LED3  19-217/GHC-YR1S2/3T  [LED0603-RD#2]  29.08 1.6 90 bottom
LED4  KT-0603B  [LED0603-RD]  6.22 48.47 270 top
LED5  -  [LED_0603]  39.62 1.86 90 bottom
MIC1  B4013AM423-008  [MIC-SMD_BD4.0_B4013AM423-008]  2.54 7.7 0 top
MIC2  B4013AM423-008  [MIC-SMD_BD4.0_B4013AM423-008]  82.17 2.49 0 top
Q1  AO3401A  [SOT-23_L2.9-W1.3-P1.90-LS2.4-BR]  68.58 6.05 270 top
Q2  SI2302  [SOT-23-3_L2.9-W1.3-P1.90-LS2.4-BR]  73.91 5.92 90 top
Q9  AO3416  [SOT-23-3_L2.9-W1.6-P1.90-LS2.8-BR]  22.35 45.16 270 bottom
Q10  CJ2301 S1  [SOT-23-3_L3.0-W1.7-P0.95-LS2.9-BR]  19.05 44.78 90 bottom
Q11  MMBT5401  [SOT-23-3_L2.9-W1.3-P1.90-LS2.4-BR]  10.67 46.56 270 bottom
Q12  MMBT5401  [SOT-23-3_L2.9-W1.3-P1.90-LS2.4-BR]  14.1 46.56 90 bottom
R1  0Ω  [r0402]  10.03 1.48 90 bottom
R2  22Ω  [LL_0402]  49.78 31.19 135 top
R3  1MΩ  [LL_0402]  49.15 30.56 135 top
R4  0Ω  [LL_0402]  54.74 29.86 180 top
R5  10kΩ  [r0402]  2.29 35.38 0 top
R6  2.2kΩ  [LL_0402]  54.74 28.84 0 top
R7  0Ω  [r0402]  12.32 1.48 90 bottom
R8  15kΩ  [r0402]  5.59 9.48 0 top
R9  300k  [R0402]  32.51 2.36 180 bottom
R10  0Ω  [r0402]  1.54 8.31 180 bottom
R11  1kΩ  [R0402]  71.5 4.65 0 top
R12  200kΩ  [r0402]  41.25 10.14 270 top
R13  100Ω  [r0402]  43.08 9.12 270 top
R14  22Ω  [RR_0402]  43.94 39.45 90 bottom
R15  200kΩ  [r0402]  42.16 11.02 270 top
R16  10K  [R0402]  76.2 6.56 90 top
R17  1kΩ  [R0402]  27.81 2.87 90 bottom
R19  0Ω  [r0402]  46.33 8.98 0 top
R20  22Ω  [R0402]  29.57 12.43 90 bottom
R21  22Ω  [R0402]  28.24 12.43 90 bottom
R22  22Ω  [R0402]  26.92 12.4 90 bottom
R24  300k  [R0402]  33.66 7.19 90 bottom
R25  5K  [R0603_1]  41.02 4.52 270 bottom
R26  5K  [R0603_1]  39.62 4.54 270 bottom
R27  10K  [R0603_1]  84.77 18.03 270 top
R28  2.2Ω  [r0402]  10.8 31.83 90 top
R29  0Ω  [r0402]  9.36 23.64 90 top
R30  0Ω  [r0402]  6.6 23.64 90 top
R31  2Ω  [R0805]  59.56 20.02 90 top
R32  47kΩ  [LL_0402]  67.4 21.13 180 top
R33  232kΩ  [LL_0402]  69.33 16.73 180 top
R34  2.2Ω  [r0402]  9.91 31.83 90 top
R35  30kΩ  [LL_0402]  69.33 18.89 0 top
R36  47kΩ  [LL_0402]  59.31 30.69 180 top
R37  232kΩ  [LL_0402]  62.36 36.24 0 top
R38  510Ω  [r0402]  6.22 46.05 270 top
R39  4.7kΩ  [LL_0402]  6.19 46.26 90 bottom
R40  51kΩ  [LL_0402]  60.32 35.26 0 top
R41  0402WGF1000TCE  [LL_0402]  76.58 21.67 90 bottom
R42  0402WGF1000TCE  [LL_0402]  70.89 37.05 0 bottom
R43  0402WGF1000TCE  [LL_0402]  77.09 29.88 90 bottom
R44  47kΩ  [LL_0402]  65.31 17.41 270 bottom
R45  120kΩ  [LL_0402]  64.48 17.41 270 bottom
R46  0Ω  [LL_0402]  60.83 34.19 0 bottom
R47  22Ω  [R0402]  23.19 12.43 90 bottom
R48  180kΩ  [LL_0402]  68.96 30.69 180 top
R49  10kΩ  [LL_0402]  74.42 30.05 270 bottom
R50  0Ω  [LL_0402]  72.77 30.81 0 bottom
R51  56kΩ  [LL_0402]  67.44 29.16 270 top
R52  10kΩ  [LL_0402]  72.26 31.57 0 bottom
R53  0402WGF5102TCE  [LL_0402]  58.69 23.41 180 bottom
R54  0402WGF1000TCE  [LL_0402]  55.75 25.9 0 bottom
R55  0Ω  [LL_0402]  63.5 47.45 270 bottom
R56  NC  [LL_0402]  64.52 47.45 270 bottom
R57  22Ω  [LL_0402]  57.28 25.35 90 bottom
R58  10kΩ  [LL_0402]  56.13 31.32 90 top
R59  0Ω  [LL_0402]  28.87 45.2 0 bottom
R60  NC  [LL_0402]  28.87 46.22 0 bottom
R61  NC  [LL_0402]  55.25 31.32 90 top
R62  22Ω  [R0402]  21.99 12.43 90 bottom
R63  100kΩ  [r0402]  5.21 38.18 270 top
R65  0.5  [R1206]  86.8 9.65 270 top
R66  5.1kΩ  [LL_0402]  15.49 40.72 90 bottom
R67  5.1kΩ  [LL_0402]  10.54 42.5 90 bottom
R68  10kΩ  [LL_0402]  14.48 42.5 270 bottom
R69  15kΩ  [LL_0402]  14.48 40.72 270 bottom
R70  10kΩ  [LL_0402]  10.16 49.23 180 bottom
R71  51kΩ  [LL_0402]  15.49 42.5 270 bottom
R72  2.2Ω  [LL_0402]  12.31 40.72 90 bottom
R73  100K  [R0603_1]  82.88 11.3 180 top
R74  10K  [R0603_1]  86.16 18.03 90 top
R77  2.2Ω  [LL_0402]  13.3 40.72 90 bottom
R86  6.8kΩ  [R0402]  33.78 12.02 180 bottom
R90  10kΩ  [LL_0402]  54.74 2.49 270 top
R91  10kΩ  [LL_0402]  59.44 2.49 270 top
R92  150kΩ  [LL_0402]  66.04 4.4 180 top
R93  10kΩ  [LL_0402]  60.45 2.49 90 top
R94  150kΩ  [LL_0402]  66.04 2.62 0 top
R95  3.6Ω  [LL_0603]  83.95 28.91 0 top
R96  3.6Ω  [LL_0603]  83.95 27.51 0 top
R97  100kΩ  [LL_0402]  82.8 21.41 270 top
R106  10kΩ-NC  [LL_0402]  73.41 38.4 90 bottom
R107  0Ω-NC  [LL_0402]  65.66 40.46 0 top
R108  4.7kΩ-NC  [LL_0402]  65.66 44.06 0 top
R112  425  [R0402]  32.77 7.19 270 bottom
R114  0402WGF1000TCE  [R0402]  20.54 12.43 90 bottom
R115  0402WGF1000TCE  [LL_0402]  82.93 6.43 180 bottom
R116  2.2kΩ  [LL_0402]  82.93 5.41 0 bottom
R117  0402WGF1000TCE  [LL_0402]  77.22 49.1 0 top
R119  0402WGF1000TCE  [LL_0402]  51.31 48.34 90 top
R120  10kΩ  [LL_0402]  52.32 48.34 270 top
R121  0402WGF1000TCE  [LL_0402]  85.35 29.94 0 top
R122  30kΩ  [LL_0402]  59.31 29.67 0 top
R123  1K  [R0603]  45.09 11.13 270 bottom
R124  10K  [R0603]  34.04 9.98 90 bottom
R125  10K  [R0603]  43.43 1.73 0 bottom
R184  100kΩ  [LL_0402]  79.83 28.4 90 top
R186  NC  [LL_0402]  76.07 27.38 90 top
R287  0Ω  [LL_0402]  79.12 17.86 90 top
R402  0Ω  [LL_0402]  14.6 32.08 180 bottom
R424  10kΩ  [LL_0402]  34.04 44.02 180 bottom
R425  10kΩ/NC  [LL_0402]  37.16 40.23 180 bottom
R426  0Ω  [LL_0402]  34.92 43.26 0 bottom
R427  47kΩ/NC  [LL_0402]  33.68 42.8 270 bottom
R428  10kΩ  [LL_0402]  35.69 44.15 180 bottom
R513  232kΩ  [r0402]  9.84 29.99 270 top
R517  49.9kΩ  [r0402]  8.13 31.19 270 top
R604  240Ω  [RR_0201]  20.95 20.14 270 bottom
R605  240Ω  [RR_0201]  21.86 20.16 270 bottom
R611  0Ω/NC  [LL_0402]  14.48 23.57 180 bottom
R612  0Ω  [LL_0402]  16.26 35.64 270 bottom
R614  0Ω  [LL_0402]  76.96 27.38 270 top
R626  0Ω  [r0402]  1.52 29.29 90 top
R627  0Ω  [r0402]  2.92 29.29 90 top
R628  10kΩ  [r0402]  2.16 18.87 270 top
R629  10kΩ  [r0402]  7.11 15.19 0 top
R630  10kΩ  [r0402]  7.11 16.14 0 top
R632  1kΩ  [LL_0402]  24.64 45.29 90 bottom
R636  0Ω  [RR_0201]  45.85 27.89 90 bottom
R637  2.2kΩ  [LL_0402]  54.74 27.83 0 top
R638  2.2kΩ  [LL_0402]  54.74 26.81 0 top
R639  2.2kΩ  [LL_0402]  54.74 25.8 0 top
R640  0Ω  [LL_0402]  37.21 42.62 270 bottom
R641  22Ω  [LL_0402]  37.21 35.26 315 top
R642  0Ω  [r0402]  5.09 10.92 270 top
R647  22Ω  [LL_0402]  45.85 39.19 180 top
R651  2.2kΩ  [RR_0402]  49.08 9.17 0 top
R652  2.2kΩ  [RR_0402]  49.08 8.2 0 top
R655  NC  [LL_0402]  58.93 34.19 0 bottom
R662  120Ω  [RR_0201]  35.05 24.08 180 bottom
R664  10kΩ  [RR_0201]  40.19 31.45 270 bottom
RF1  BWIPX-1-001E  [IPEX-SMD_BWIPX-1-001E]  87.76 41.23 0 top
SW1  K2-1112SA-A4DW-01  [KEY-TH_K2-1112SA-AXXW-XX]  71.12 2.24 180 top
SW2  PTS815SJK250SMTRLFS  [SW-SMD_4P-L4.2-W3.3-P2.15-LS5.1]  56.01 47.7 0 top
SW3  PTS815SJK250SMTRLFS  [SW-SMD_4P-L4.2-W3.3-P2.15-LS5.1]  87.54 33.99 90 top
SW4  K2-1112SA-A4DW-01  [KEY-TH_K2-1112SA-AXXW-XX]  80.39 48.59 180 bottom
SW12  PTS815SJK250SMTRLFS  [SW-SMD_4P-L4.2-W3.3-P2.15-LS5.1]  33.26 39.14 180 bottom
U1  -  [BGA-565_L15.5-W14.4-P0.40_RK3566_1]  41.31 25.93 45 top
U2  SY8113BADC  [TSOT-23-6_L2.9-W1.6-P0.95-LS2.8-BR]  5.53 33.55 0 top
U3  -  [TCS4525]  56.77 23.83 180 bottom
U4  3.3uH  [IND-SMD_L2.5-W2.0]  5.97 29.16 180 top
U5  MP5016HGQH-P  [QFN-10_L2.0-W1.5-P0.5-BL_MP5016HGLH-Z]  32.77 4.4 90 bottom
U6  CW2015CHBD  [TDFN-8_L3.0-W2.0-P0.50-BL-EP]  45.69 10.76 270 top
U7  TP5108E23E-28  [SOT-23-5_L3.0-W1.7-P0.95-LS2.8-BL]  52.58 3.51 0 top
U8  TP5108E23E-18  [SOT-23-5_L3.0-W1.7-P0.95-LS2.8-BL]  57.4 3.51 0 top
U9  SY8089AAAC  [SOT-23-5_L3.0-W1.7-P0.95-LS2.8-BR]  63.5 3.38 90 top
U10  MP2615CGQ-P  [QFN-16_L3.0-W3.0-P0.5-BL_MP2615CGQ-P]  83.62 13.84 0 top
U11  SS54  [SMA_L4.2-W2.6-LS5.1-RD]  48.82 4.02 270 top
U12  BMP280  [WLGA-8_L2.5-W2.0-P0.65-TR_DPS422]  24.89 2.49 270 bottom
U13  -  [MINI_PCIE]  3.12 10.32 90 bottom
U14  BMI270  [LGA-14_L3.0-W2.5-P0.50-BR]  19.55 6.94 270 bottom
U15  5GHz  [QFN-44_L12.0-W12.0-P0.90-TL_AP6256]  73.66 41.35 180 top
U16  ZX-MX1.25-2PLT  [CONN-SMD_2P-P1.25-MX1.25-2P-LT]  22.1 47.45 180 top
U17  BMM150  [WLCSP-12_L1.6-W1.6_BMM150]  18.75 1.44 90 bottom
U18  ZX-MX1.25-2PLT  [CONN-SMD_2P-P1.25-MX1.25-2P-LT]  3.17 40.46 270 top
U20  ZX-MX1.25-2PLT  [CONN-SMD_2P-P1.25-MX1.25-2P-LT]  80.14 3.38 180 bottom
U21  -  [RK809-5]  66.83 25.95 180 bottom
U26  SY8089AAAC  [SOT-23-5_L3.0-W1.7-P0.95-LS2.8-BR]  77.47 30.94 0 top
U32  CH224K  [ESSOP-10_L4.9-W3.9-P1.0-LS6.0-TL-EP]  38.86 11 270 bottom
U98  AO3401  [SOT-23-3_L2.9-W1.6-P1.90-LS2.8-BR]  43.31 4.4 270 bottom
U114  -  [BGA200_LPDDR4_4X]  21.04 27 0 top
U120  -  [VFBGA-153_L13.0-W11.5-P0.50-BL]  33.78 43.64 270 top
U121  470nH  [IND-SMD_L2.5-W2.0]  73.81 27.47 0 bottom
U122  470nH  [IND-SMD_L2.5-W2.0]  73.81 23.41 0 bottom
U123  470nH  [IND-SMD_L2.5-W2.0]  67.06 19 90 bottom
U124  470nH  [IND-SMD_L2.5-W2.0]  68.99 32.8 270 bottom
U125  470nH  [IND-SMD_L2.5-W2.0]  63.02 32.82 270 bottom
U126  -  [M3外5内3]  87.03 2.78 0 top
U127  -  [M3外5内3]  2.92 47.58 0 top
U128  -  [M3外5内3]  3 2.78 0 top
U129  -  [M3外5内3]  87.03 47.62 0 top
U131  SY8113BADC  [TSOT-23-6_L2.9-W1.6-P0.95-LS2.8-BR]  66.55 19 0 top
U132  SY8113BADC  [TSOT-23-6_L2.9-W1.6-P0.95-LS2.8-BR]  60.32 32.97 90 top
U138  NS4150B  [MSOP-8_L3.0-W3.0-P0.65-LS5.0-BL]  4.7 19.89 0 top
U140  SY7201ABC  [SOT-23-6_L2.9-W1.6-P0.95-LS2.8-BR]  84.02 24.59 90 top
U141  TS3USB221ARSER  [UQFN-10_L2.0-W1.5-P0.50-BL]  7.11 40.46 90 top
USB1  KH-TYPE-C-16P  [USB-C-SMD_KH-TYPE-C-16P]  12.32 45.54 180 top
USB7  TYPE-C 16PIN 2MD(073)  [USB-C-SMD_TYPE-C-6PIN-2MD-073]  41.78 5.03 0 top
X1  37.4MHz  [CRYSTAL-SMD_4P-L2.0-W1.6-BL-2]  82.3 45.29 270 top
X2  32.768kHz  [CRYSTAL-SMD_L3.2-W1.5-1]  59.56 28.53 270 bottom
X6  24MHz  [CRYSTAL-SMD_4P-L2.0-W1.6-BL]  51.71 33.11 135 top

## Footprints (pads in the part's own frame, mm; a bottom-side part is the same pattern mirrored in y, then rotated)
BGA200_LPDDR4_4X
  round 0.3 hole 0.001: A1(4.444,-6.71) A2(3.643,-6.71) A3(2.844,-6.71) A4(2.043,-6.71) A5(1.243,-6.71) A8(-1.157,-6.71) A9(-1.956,-6.71) A10(-2.757,-6.71) A11(-3.557,-6.71) A12(-4.356,-6.71) AA1(4.444,6.29) AA2(3.643,6.29) AA3(2.844,6.29) AA4(2.043,6.29) AA5(1.243,6.29) AA8(-1.157,6.29) AA9(-1.956,6.29) AA10(-2.757,6.29) AA11(-3.557,6.29) AA12(-4.356,6.29) AB1(4.444,6.939) AB2(3.643,6.939) AB3(2.844,6.939) AB4(2.043,6.939) AB5(1.243,6.939) AB8(-1.157,6.939) AB9(-1.956,6.939) AB10(-2.757,6.939) AB11(-3.557,6.939) AB12(-4.356,6.939) B1(4.444,-6.061) B2(3.643,-6.061) B3(2.844,-6.061) B4(2.043,-6.061) B5(1.243,-6.061) B8(-1.157,-6.061) B9(-1.956,-6.061) B10(-2.757,-6.061) B11(-3.557,-6.061) B12(-4.356,-6.061) C1(4.444,-5.41) C2(3.643,-5.41) C3(2.844,-5.41) C4(2.043,-5.41) C5(1.243,-5.41) C8(-1.157,-5.41) C9(-1.956,-5.41) C10(-2.757,-5.41) C11(-3.557,-5.41) C12(-4.356,-5.41) D1(4.444,-4.761) D2(3.643,-4.761) D3(2.844,-4.761) D4(2.043,-4.761) D5(1.243,-4.761) D8(-1.157,-4.761) D9(-1.956,-4.761) D10(-2.757,-4.761) D11(-3.557,-4.761) D12(-4.356,-4.761) E1(4.444,-4.111) E2(3.643,-4.111) E3(2.844,-4.111) E4(2.043,-4.111) E5(1.243,-4.111) E8(-1.157,-4.111) E9(-1.956,-4.111) E10(-2.757,-4.111) E11(-3.557,-4.111) E12(-4.356,-4.111) F1(4.444,-3.461) F2(3.643,-3.461) F3(2.844,-3.461) F4(2.043,-3.461) F5(1.243,-3.461) F8(-1.157,-3.461) F9(-1.956,-3.461) F10(-2.757,-3.461) F11(-3.557,-3.461) F12(-4.356,-3.461) G1(4.444,-2.811) G2(3.643,-2.811) G3(2.844,-2.811) G4(2.043,-2.811) G5(1.243,-2.811) G8(-1.157,-2.811) G9(-1.956,-2.811) G10(-2.757,-2.811) G11(-3.557,-2.811) G12(-4.356,-2.811) H1(4.444,-2.161) H2(3.643,-2.161) H3(2.844,-2.161) H4(2.043,-2.161) H5(1.243,-2.161) H8(-1.157,-2.161) H9(-1.956,-2.161) H10(-2.757,-2.161) H11(-3.557,-2.161) H12(-4.356,-2.161) J1(4.444,-1.511) J2(3.643,-1.511) J3(2.844,-1.511) J4(2.043,-1.511) J5(1.243,-1.511) J8(-1.157,-1.511) J9(-1.956,-1.511) J10(-2.757,-1.511) J11(-3.557,-1.511) J12(-4.356,-1.511) K1(4.444,-0.861) K2(3.643,-0.861) K3(2.844,-0.861) K4(2.043,-0.861) K5(1.243,-0.861) K8(-1.157,-0.861) K9(-1.956,-0.861) K10(-2.757,-0.861) K11(-3.557,-0.861) K12(-4.356,-0.861) N1(4.444,1.089) N2(3.643,1.089) N3(2.844,1.089) N4(2.043,1.089) N5(1.243,1.089) N8(-1.157,1.089) N9(-1.956,1.089) N10(-2.757,1.089) N11(-3.557,1.089) N12(-4.356,1.089) P1(4.444,1.74) P2(3.643,1.74) P3(2.844,1.74) P4(2.043,1.74) P5(1.243,1.74) P8(-1.157,1.74) P9(-1.956,1.74) P10(-2.757,1.74) P11(-3.557,1.74) P12(-4.356,1.74) R1(4.444,2.389) R2(3.643,2.389) R3(2.844,2.389) R4(2.043,2.389) R5(1.243,2.389) R8(-1.157,2.389) R9(-1.956,2.389) R10(-2.757,2.389) R11(-3.557,2.389) R12(-4.356,2.389) T1(4.444,3.039) T2(3.643,3.039) T3(2.844,3.039) T4(2.043,3.039) T5(1.243,3.039) T8(-1.157,3.039) T9(-1.956,3.039) T10(-2.757,3.039) T11(-3.557,3.039) T12(-4.356,3.039) U1(4.444,3.689) U2(3.643,3.689) U3(2.844,3.689) U4(2.043,3.689) U5(1.243,3.689) U8(-1.157,3.689) U9(-1.956,3.689) U10(-2.757,3.689) U11(-3.557,3.689) U12(-4.356,3.689) V1(4.444,4.34) V2(3.643,4.34) V3(2.844,4.34) V4(2.043,4.34) V5(1.243,4.34) V8(-1.157,4.34) V9(-1.956,4.34) V10(-2.757,4.34) V11(-3.557,4.34) V12(-4.356,4.34) W1(4.444,4.989) W2(3.643,4.989) W3(2.844,4.989) W4(2.043,4.989) W5(1.243,4.989) W8(-1.157,4.989) W9(-1.956,4.989) W10(-2.757,4.989) W11(-3.557,4.989) W12(-4.356,4.989) Y1(4.444,5.639) Y2(3.643,5.639) Y3(2.844,5.639) Y4(2.043,5.639) Y5(1.243,5.639) Y8(-1.157,5.639) Y9(-1.956,5.639) Y10(-2.757,5.639) Y11(-3.557,5.639) Y12(-4.356,5.639)
BGA-565_L15.5-W14.4-P0.40_RK3566_1
  round 0.22 hole 0.001: 1A1(-6.175,5.525) 1A2(-5.525,5.525) 1A3(-4.875,5.525) 1A4(-4.225,5.525) 1A5(-3.575,5.525) 1A6(-2.925,5.525) 1A7(-2.275,5.525) 1A8(-1.625,5.525) 1A9(-0.975,5.525) 1A10(-0.325,5.525) 1A11(0.325,5.525) 1A13(1.625,5.525) 1A14(2.275,5.525) 1A15(2.925,5.525) 1A16(3.575,5.525) 1A17(4.225,5.525) 1A18(4.875,5.525) 1A19(5.525,5.525) 1A20(6.175,5.525) 1B1(-6.175,4.875) 1B3(-4.875,4.875) 1B5(-3.575,4.875) 1B6(-2.925,4.875) 1B7(-2.275,4.875) 1B8(-1.625,4.875) 1B9(-0.975,4.875) 1B10(-0.325,4.875) 1B11(0.325,4.875) 1B13(1.625,4.875) 1B14(2.275,4.875) 1B15(2.925,4.875) 1B16(3.575,4.875) 1B17(4.225,4.875) 1B18(4.875,4.875) 1B19(5.525,4.875) 1B20(6.175,4.875) 1C1(-6.175,4.225) 1C2(-5.525,4.225) 1C3(-4.875,4.225) 1C4(-4.225,4.225) 1C5(-3.575,4.225) 1C6(-2.925,4.225) 1C7(-2.275,4.225) 1C8(-1.625,4.225) 1C9(-0.975,4.225) 1C10(-0.325,4.225) 1C12(0.975,4.225) 1C13(1.625,4.225) 1C14(2.275,4.225) 1C15(2.925,4.225) 1C16(3.575,4.225) 1C17(4.225,4.225) 1C18(4.875,4.225) 1C19(5.525,4.225) 1C20(6.175,4.225) 1D1(-6.175,3.575) 1D2(-5.525,3.575) 1D3(-4.875,3.575) 1D4(-4.225,3.575) 1D5(-3.575,3.575) 1D6(-2.925,3.575) 1D7(-2.275,3.575) 1D8(-1.625,3.575) 1D9(-0.975,3.575) 1D10(-0.325,3.575) 1D11(0.325,3.575) 1D12(0.975,3.575) 1D13(1.625,3.575) 1D14(2.275,3.575) 1D15(2.925,3.575) 1D16(3.575,3.575) 1D17(4.225,3.575) 1D18(4.875,3.575) 1D19(5.525,3.575) 1D20(6.175,3.575) 1E1(-6.175,2.925) 1E2(-5.525,2.925) 1E3(-4.875,2.925) 1E4(-4.225,2.925) 1E6(-2.925,2.925) 1E7(-2.275,2.925) 1E8(-1.625,2.925) 1E9(-0.975,2.925) 1E10(-0.325,2.925) 1E11(0.325,2.925) 1E12(0.975,2.925) 1E13(1.625,2.925) 1E14(2.275,2.925) 1E15(2.925,2.925) 1E16(3.575,2.925) 1E17(4.225,2.925) 1E18(4.875,2.925) 1E19(5.525,2.925) 1E20(6.175,2.925) 1F1(-6.175,2.275) 1F2(-5.525,2.275) 1F3(-4.875,2.275) 1F4(-4.225,2.275) 1F5(-3.575,2.275) 1F6(-2.925,2.275) 1F7(-2.275,2.275) 1F8(-1.625,2.275) 1F9(-0.975,2.275) 1F10(-0.325,2.275) 1F11(0.325,2.275) 1F12(0.975,2.275) 1F13(1.625,2.275) 1F14(2.275,2.275) 1F15(2.925,2.275) 1F16(3.575,2.275) 1F17(4.225,2.275) 1F18(4.875,2.275) 1F19(5.525,2.275) 1F20(6.175,2.275) 1G1(-6.175,1.625) 1G2(-5.525,1.625) 1G3(-4.875,1.625) 1G4(-4.225,1.625) 1G5(-3.575,1.625) 1G6(-2.925,1.625) 1G7(-2.275,1.625) 1G8(-1.625,1.625) 1G9(-0.975,1.625) 1G10(-0.325,1.625) 1G11(0.325,1.625) 1G12(0.975,1.625) 1G13(1.625,1.625) 1G14(2.275,1.625) 1G15(2.925,1.625) 1G16(3.575,1.625) 1G17(4.225,1.625) 1G18(4.875,1.625) 1G19(5.525,1.625) 1G20(6.175,1.625) 1H1(-6.175,0.975) 1H2(-5.525,0.975) 1H3(-4.875,0.975) 1H4(-4.225,0.975) 1H5(-3.575,0.975) 1H6(-2.925,0.975) 1H7(-2.275,0.975) 1H8(-1.625,0.975) 1H9(-0.975,0.975) 1H10(-0.325,0.975) 1H11(0.325,0.975) 1H12(0.975,0.975) 1H13(1.625,0.975) 1H14(2.275,0.975) 1H15(2.925,0.975) 1H16(3.575,0.975) 1H17(4.225,0.975) 1H18(4.875,0.975) 1H19(5.525,0.975) 1H20(6.175,0.975) 1J1(-6.175,0.325) 1J2(-5.525,0.325) 1J3(-4.875,0.325) 1J4(-4.225,0.325) 1J5(-3.575,0.325) 1J6(-2.925,0.325) 1J7(-2.275,0.325) 1J8(-1.625,0.325) 1J9(-0.975,0.325) 1J10(-0.325,0.325) 1J11(0.325,0.325) 1J12(0.975,0.325) 1J13(1.625,0.325) 1J14(2.275,0.325) 1J15(2.925,0.325) 1J16(3.575,0.325) 1J17(4.225,0.325) 1J18(4.875,0.325) 1J19(5.525,0.325) 1J20(6.175,0.325) 1K2(-5.525,-0.325) 1K3(-4.875,-0.325) 1K4(-4.225,-0.325) 1K5(-3.575,-0.325) 1K6(-2.925,-0.325) 1K7(-2.275,-0.325) 1K8(-1.625,-0.325) 1K9(-0.975,-0.325) 1K10(-0.325,-0.325) 1K11(0.325,-0.325) 1K12(0.975,-0.325) 1K13(1.625,-0.325) 1K14(2.275,-0.325) 1K15(2.925,-0.325) 1K16(3.575,-0.325) 1K17(4.225,-0.325) 1K18(4.875,-0.325) 1K19(5.525,-0.325) 1K20(6.175,-0.325) 1L1(-6.175,-0.975) 1L2(-5.525,-0.975) 1L3(-4.875,-0.975) 1L4(-4.225,-0.975) 1L5(-3.575,-0.975) 1L6(-2.925,-0.975) 1L7(-2.275,-0.975) 1L8(-1.625,-0.975) 1L9(-0.975,-0.975) 1L10(-0.325,-0.975) 1L11(0.325,-0.975) 1L12(0.975,-0.975) 1L13(1.625,-0.975) 1L14(2.275,-0.975) 1L15(2.925,-0.975) 1L19(5.525,-0.975) 1M3(-4.875,-1.625) 1M4(-4.225,-1.625) 1M5(-3.575,-1.625) 1M6(-2.925,-1.625) 1M7(-2.275,-1.625) 1M8(-1.625,-1.625) 1M9(-0.975,-1.625) 1M10(-0.325,-1.625) 1M11(0.325,-1.625) 1M12(0.975,-1.625) 1M13(1.625,-1.625) 1M14(2.275,-1.625) 1M15(2.925,-1.625) 1M16(3.575,-1.625) 1M17(4.225,-1.625) 1M18(4.875,-1.625) 1M19(5.525,-1.625) 1M20(6.175,-1.625) 1N1(-6.175,-2.275) 1N2(-5.525,-2.275) 1N3(-4.875,-2.275) 1N4(-4.225,-2.275) 1N5(-3.575,-2.275) 1N6(-2.925,-2.275) 1N7(-2.275,-2.275) 1N8(-1.625,-2.275) 1N9(-0.975,-2.275) 1N10(-0.325,-2.275) 1N11(0.325,-2.275) 1N12(0.975,-2.275) 1N13(1.625,-2.275) 1N14(2.275,-2.275) 1N15(2.925,-2.275) 1N16(3.575,-2.275) 1N17(4.225,-2.275) 1N18(4.875,-2.275) 1N19(5.525,-2.275) 1N20(6.175,-2.275) 1P1(-6.175,-2.925) 1P2(-5.525,-2.925) 1P3(-4.875,-2.925) 1P4(-4.225,-2.925) 1P5(-3.575,-2.925) 1P6(-2.925,-2.925) 1P7(-2.275,-2.925) 1P8(-1.625,-2.925) 1P9(-0.975,-2.925) 1P10(-0.325,-2.925) 1P11(0.325,-2.925) 1P12(0.975,-2.925) 1P13(1.625,-2.925) 1P14(2.275,-2.925) 1P15(2.925,-2.925) 1P16(3.575,-2.925) 1P17(4.225,-2.925) 1P18(4.875,-2.925) 1P19(5.525,-2.925) 1P20(6.175,-2.925) 1R1(-6.175,-3.575) 1R2(-5.525,-3.575) 1R3(-4.875,-3.575) 1R4(-4.225,-3.575) 1R5(-3.575,-3.575) 1R6(-2.925,-3.575) 1R7(-2.275,-3.575) 1R8(-1.625,-3.575) 1R9(-0.975,-3.575) 1R10(-0.325,-3.575) 1R11(0.325,-3.575) 1R12(0.975,-3.575) 1R13(1.625,-3.575) 1R14(2.275,-3.575) 1R15(2.925,-3.575) 1R16(3.575,-3.575) 1R17(4.225,-3.575) 1R18(4.875,-3.575) 1R19(5.525,-3.575) 1R20(6.175,-3.575) 1T1(-6.175,-4.225) 1T2(-5.525,-4.225) 1T3(-4.875,-4.225) 1T4(-4.225,-4.225) 1T5(-3.575,-4.225) 1T6(-2.925,-4.225) 1T7(-2.275,-4.225) 1T8(-1.625,-4.225) 1T9(-0.975,-4.225) 1T10(-0.325,-4.225) 1T11(0.325,-4.225) 1T12(0.975,-4.225) 1T13(1.625,-4.225) 1T14(2.275,-4.225) 1T15(2.925,-4.225) 1T16(3.575,-4.225) 1T17(4.225,-4.225) 1T18(4.875,-4.225) 1T19(5.525,-4.225) 1T20(6.175,-4.225) 1U1(-6.175,-4.875) 1U2(-5.525,-4.875) 1U3(-4.875,-4.875) 1U4(-4.225,-4.875) 1U5(-3.575,-4.875) 1U6(-2.925,-4.875) 1U7(-2.275,-4.875) 1U8(-1.625,-4.875) 1U9(-0.975,-4.875) 1U11(0.325,-4.875) 1U12(0.975,-4.875) 1U13(1.625,-4.875) 1U15(2.925,-4.875) 1U16(3.575,-4.875) 1U17(4.225,-4.875) 1U18(4.875,-4.875) 1U19(5.525,-4.875) 1U20(6.175,-4.875) 1V1(-6.175,-5.525) 1V2(-5.525,-5.525) 1V3(-4.875,-5.525) 1V4(-4.225,-5.525) 1V5(-3.575,-5.525) 1V6(-2.925,-5.525) 1V7(-2.275,-5.525) 1V8(-1.625,-5.525) 1V9(-0.975,-5.525) 1V11(0.325,-5.525) 1V12(0.975,-5.525) 1V13(1.625,-5.525) 1V15(2.925,-5.525) 1V16(3.575,-5.525) 1V17(4.225,-5.525) 1V18(4.875,-5.525) 1V19(5.525,-5.525) 1V20(6.175,-5.525) A1(-7.4,6.8) A2(-7,6.8) A3(-6.6,6.8) A5(-5.8,6.8) A7(-5,6.8) A9(-4.2,6.8) A10(-3.8,6.8) A12(-3,6.8) A13(-2.6,6.8) A15(-1.8,6.8) A17(-1,6.8) A19(-0.2,6.8) A20(0.2,6.8) A22(1,6.8) A23(1.4,6.8) A26(2.6,6.8) A27(3,6.8) A29(3.8,6.8) A30(4.2,6.8) A32(5,6.8) A33(5.4,6.8) A35(6.2,6.8) A37(7,6.8) A38(7.4,6.8) AA2(-7,-1.2) AA37(7,-1.2) AA38(7.4,-1.2) AB1(-7.4,-1.6) AB2(-7,-1.6) AB37(7,-1.6) AB38(7.4,-1.6) AC2(-7,-2) AC37(7,-2) AD1(-7.4,-2.4) AD2(-7,-2.4) AD37(7,-2.4) AD38(7.4,-2.4) AE2(-7,-2.8) AE37(7,-2.8) AF1(-7.4,-3.2) AF2(-7,-3.2) AF37(7,-3.2) AF38(7.4,-3.2) AG2(-7,-3.6) AG37(7,-3.6) AG38(7.4,-3.6) AH2(-7,-4) AH37(7,-4) AJ1(-7.4,-4.4) AJ2(-7,-4.4) AJ37(7,-4.4) AJ38(7.4,-4.4) AK2(-7,-4.8) AK37(7,-4.8) AK38(7.4,-4.8) AL1(-7.4,-5.2) AL2(-7,-5.2) AL37(7,-5.2) AM1(-7.4,-5.6) AM2(-7,-5.6) AM37(7,-5.6) AM38(7.4,-5.6) AN2(-7,-6) AN37(7,-6) AN38(7.4,-6) AP1(-7.4,-6.4) AP2(-7,-6.4) AP3(-6.6,-6.4) AP4(-6.2,-6.4) AP5(-5.8,-6.4) AP6(-5.4,-6.4) AP7(-5,-6.4) AP8(-4.6,-6.4) AP9(-4.2,-6.4) AP10(-3.8,-6.4) AP11(-3.4,-6.4) AP12(-3,-6.4) AP13(-2.6,-6.4) AP14(-2.2,-6.4) AP15(-1.8,-6.4) AP16(-1.4,-6.4) AP17(-1,-6.4) AP18(-0.6,-6.4) AP19(-0.2,-6.4) AP20(0.2,-6.4) AP21(0.6,-6.4) AP22(1,-6.4) AP23(1.4,-6.4) AP24(1.8,-6.4) AP25(2.2,-6.4) AP26(2.6,-6.4) AP27(3,-6.4) AP28(3.4,-6.4) AP29(3.8,-6.4) AP30(4.2,-6.4) AP31(4.6,-6.4) AP32(5,-6.4) AP33(5.4,-6.4) AP34(5.8,-6.4) AP35(6.2,-6.4) AP36(6.6,-6.4) AP37(7,-6.4) AR1(-7.4,-6.8) AR2(-7,-6.8) AR4(-6.2,-6.8) AR6(-5.4,-6.8) AR7(-5,-6.8) AR9(-4.2,-6.8) AR10(-3.8,-6.8) AR12(-3,-6.8) AR14(-2.2,-6.8) AR15(-1.8,-6.8) AR17(-1,-6.8) AR18(-0.6,-6.8) AR20(0.2,-6.8) AR21(0.6,-6.8) AR23(1.4,-6.8) AR24(1.8,-6.8) AR26(2.6,-6.8) AR27(3,-6.8) AR29(3.8,-6.8) AR30(4.2,-6.8) AR32(5,-6.8) AR33(5.4,-6.8) AR35(6.2,-6.8) AR36(6.6,-6.8) AR38(7.4,-6.8) B1(-7.4,6.4) B2(-7,6.4) B3(-6.6,6.4) B4(-6.2,6.4) B5(-5.8,6.4) B6(-5.4,6.4) B7(-5,6.4) B8(-4.6,6.4) B9(-4.2,6.4) B10(-3.8,6.4) B11(-3.4,6.4) B12(-3,6.4) B13(-2.6,6.4) B14(-2.2,6.4) B15(-1.8,6.4) B16(-1.4,6.4) B17(-1,6.4) B18(-0.6,6.4) B19(-0.2,6.4) B20(0.2,6.4) B21(0.6,6.4) B22(1,6.4) B23(1.4,6.4) B24(1.8,6.4) B25(2.2,6.4) B26(2.6,6.4) B27(3,6.4) B28(3.4,6.4) B29(3.8,6.4) B30(4.2,6.4) B31(4.6,6.4) B32(5,6.4) B33(5.4,6.4) B34(5.8,6.4) B35(6.2,6.4) B36(6.6,6.4) B37(7,6.4) B38(7.4,6.4) C1(-7.4,6) C2(-7,6) C37(7,6) D2(-7,5.6) D37(7,5.6) D38(7.4,5.6) E1(-7.4,5.2) E2(-7,5.2) E37(7,5.2) F1(-7.4,4.8) F2(-7,4.8) F37(7,4.8) F38(7.4,4.8) G2(-7,4.4) G37(7,4.4) G38(7.4,4.4) H1(-7.4,4) H2(-7,4) H37(7,4) J2(-7,3.6) J37(7,3.6) J38(7.4,3.6) K1(-7.4,3.2) K2(-7,3.2) K37(7,3.2) K38(7.4,3.2) L2(-7,2.8) L37(7,2.8) M1(-7.4,2.4) M2(-7,2.4) M37(7,2.4) M38(7.4,2.4) N1(-7.4,2) N2(-7,2) N37(7,2) N38(7.4,2) P2(-7,1.6) P37(7,1.6) R1(-7.4,1.2) R2(-7,1.2) R37(7,1.2) R38(7.4,1.2) T2(-7,0.8) T37(7,0.8) T38(7.4,0.8) U2(-7,0.4) U37(7,0.4) V1(-7.4,0) V2(-7,0) V37(7,0) V38(7.4,0) W2(-7,-0.4) W37(7,-0.4) W38(7.4,-0.4) Y1(-7.4,-0.8) Y2(-7,-0.8) Y37(7,-0.8)
c0402
  rect 0.587x0.54 hole 0.001: 1(-0.482,0) 2(0.482,0)
C0402
  rect 0.566x0.54 hole 0.001: 1(0.416,-0.013) 2(-0.45,-0.013)
C0402#2
  rect 0.566x0.54 hole 0.001: 1(-0.454,0) 2(0.509,0)
C0603
  rect 0.8x0.9 hole 0.001: 1(0.702,-0.007) 2(-0.698,-0.007)
